# EasyEDA Pro project CanMV-K230-LP4-V3.0-立创文件.epro, board CanMV-K230-LP4-V3.0_20240509
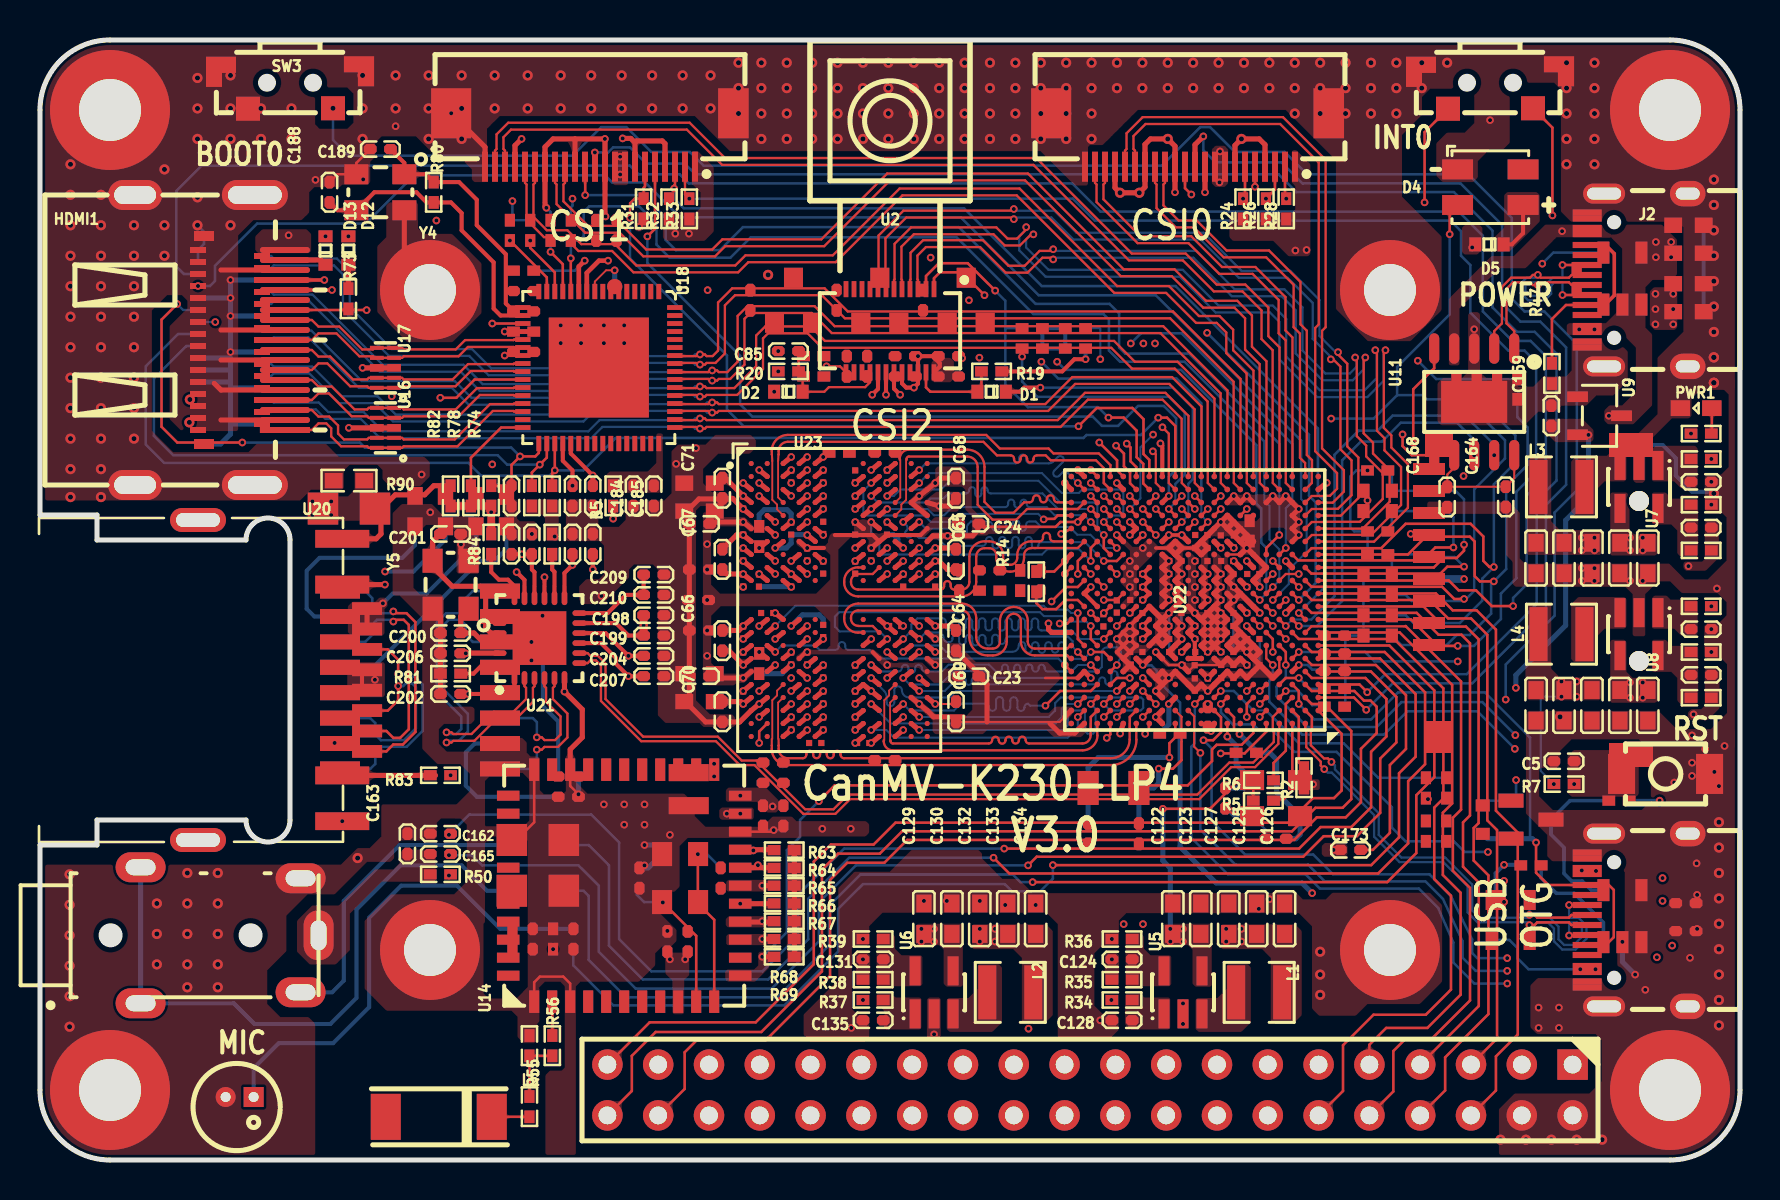
[diagram p7: board, top side]
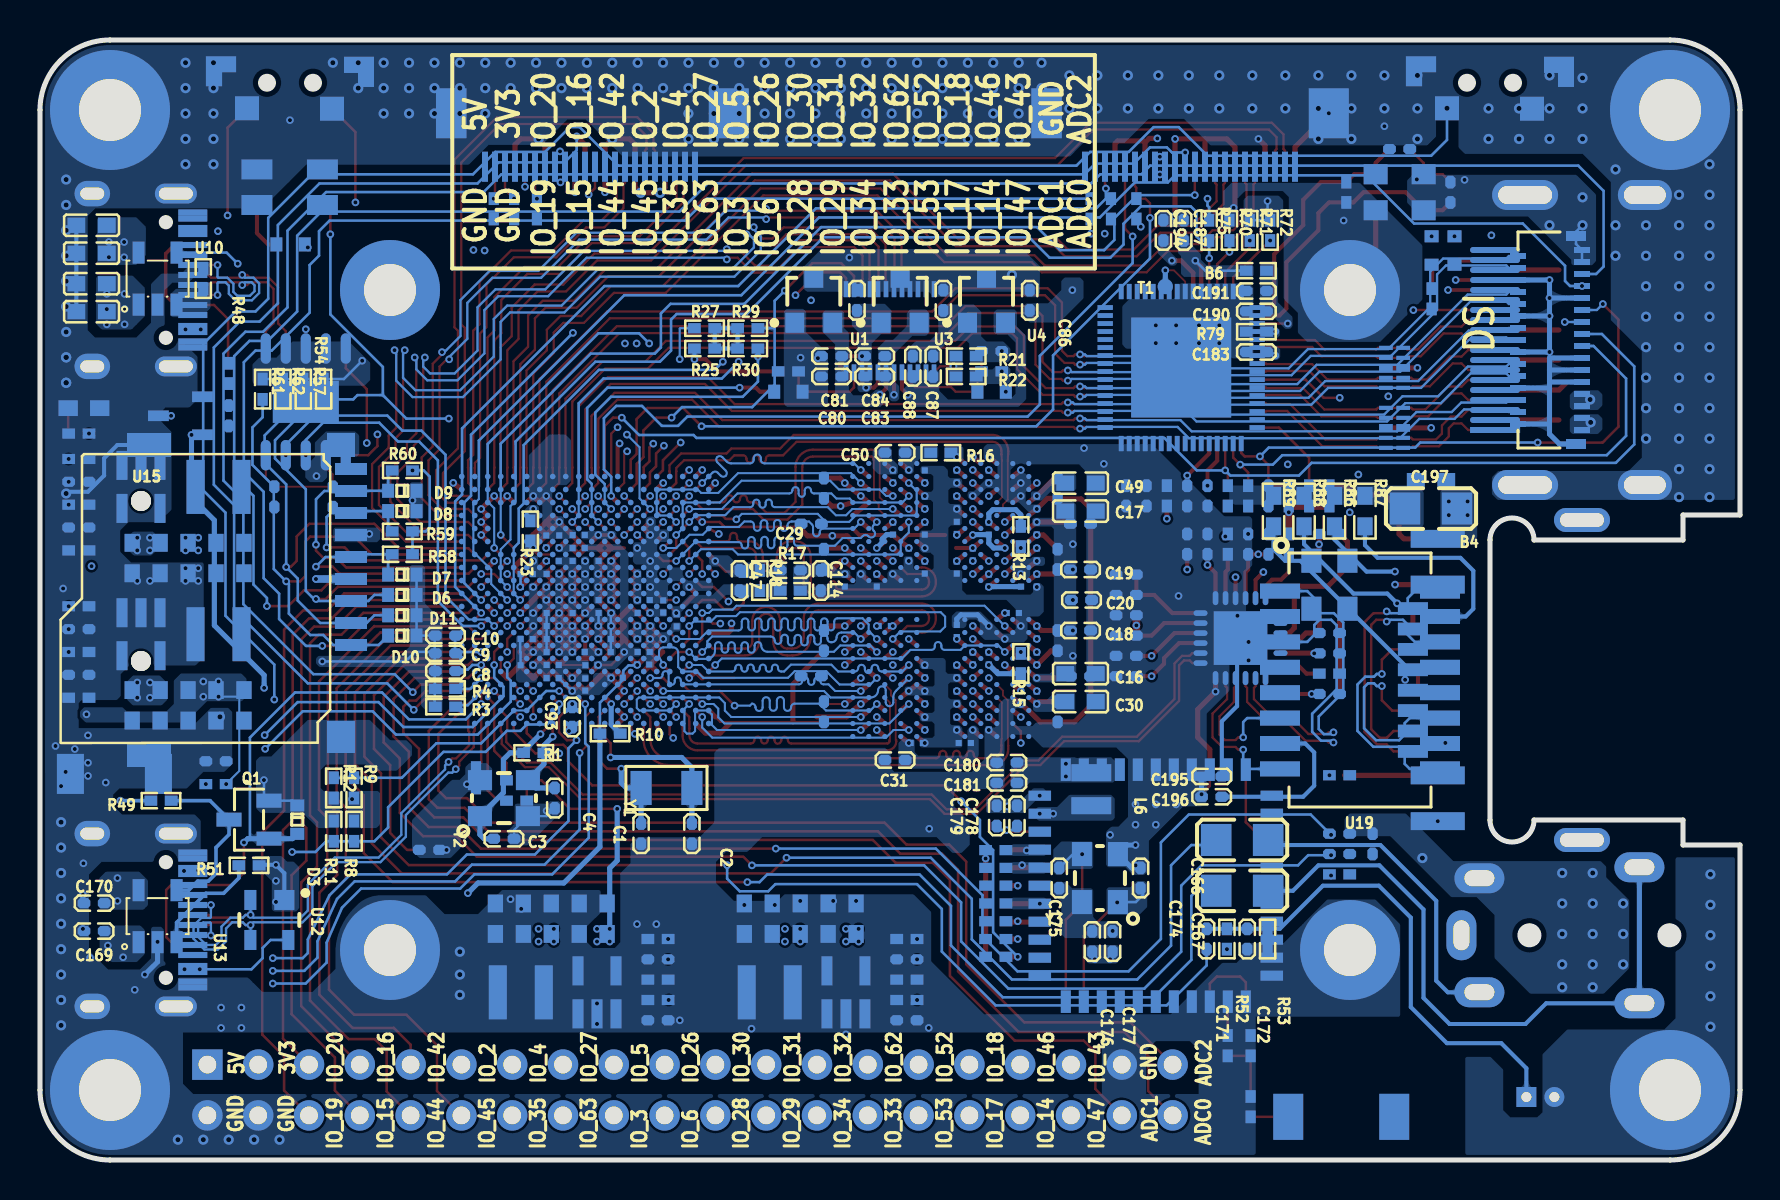
[diagram p8: board, bottom side, seen from below]

Outline 85 x 56 mm; copper layers: Top Layer, GND2, Signal3, POWER4, GND5, Bottom Layer. Coordinates in mm from the lower left corner of the outline.
Outline path: 0,52.5 arc(1.03,54.97) 3.5,56 81.5,56 arc(83.97,54.97) 85,52.5 85,3.5 arc(83.97,1.03) 81.5,0 3.5,0 arc(1.03,1.03) 0,3.5 0,15.75 2.85,15.75 2.85,17 10.3,17 arc(11.4,15.9) 12.5,17 12.5,31 arc(11.4,32.1) 10.3,31 2.85,31 2.85,32.25 0,32.25 0,52.5
Stack: Top Layer 0.035mm 外层铜厚1oz / Dielectric1 0.0994mm 3313 RC57% 4.2mil / GND2 0.035mm - / Dielectric2 0.55mm 0.55mm H/H不含铜 / Signal3 0.035mm - / Dielectric3 0.1088mm 2116 RC54% 4.9mil / POWER4 0.035mm - / Dielectric4 0.55mm 0.55mm H/H不含铜 / GND5 0.035mm - / Dielectric5 0.0994mm 3313 RC57% 4.2mil / Bottom Layer 0.035mm 外层铜厚1oz

## Design rules (mm)
net DSI_D3_P: DSI_D3_
net DSI_D2_N: DSI_D2_
net DSI_CLK_P: DSI_CLK_
net DSI_CLK_N: DSI_CLK_
net DSI_D2_P: DSI_D2_
net DSI_D3_N: DSI_D3_
net DSI_D1_P: DSI_D1_
net DSI_D1_N: DSI_D1_
net DSI_D0_P: DSI_D0_
net DSI_D0_N: DSI_D0_
net USB_N: USB_
net USB_P: USB_
net USB0_N: USB0_
net USB0_P: USB0_
net HDMI_CLK_N: HDMI_CLK_
net HDMI_CLK_P: HDMI_CLK_
net HDMI_D0_N: HDMI_D0_
net HDMI_D0_P: HDMI_D0_
net HDMI_D1_N: HDMI_D1_
net HDMI_D1_P: HDMI_D1_
net HDMI_D2_N: HDMI_D2_
net HDMI_D2_P: HDMI_D2_
net USB1_P: USB1_
net USB1_N: USB1_
net RD_P: RD_
net RD_N: RD_
net TD_N: TD_
net TD_P: TD_
net TX_P: TX_
net TX_N: TX_
net RX_P: RX_
net RX_N: RX_
net CSI2_D5_N: CSI2_D5_
net CSI2_CLK_P: CSI2_CLK_
net CSI2_CLK_N: CSI2_CLK_
net CSI2_D4_P: CSI2_D4_
net CSI2_D4_N: CSI2_D4_
net CSI2_D5_P: CSI2_D5_
net CSI0_D0_N: CSI0_D0_
net CSI0_D0_P: CSI0_D0_
net CSI0_D1_N: CSI0_D1_
net CSI0_D1_P: CSI0_D1_
net CSI0_CLK_N: CSI0_CLK_
net CSI0_CLK_P: CSI0_CLK_
net CSI1_D2_N: CSI1_D2_
net CSI1_D2_P: CSI1_D2_
net CSI1_D3_N: CSI1_D3_
net CSI1_D3_P: CSI1_D3_
net CSI1_CLK_N: CSI1_CLK_
net CSI1_CLK_P: CSI1_CLK_
net DDR_DQSA0_P: DDR_DQSA0_
net DDR_DQSA0_N: DDR_DQSA0_
net DDR_CLKA_N: DDR_CLKA_
net DDR_CLKA_P: DDR_CLKA_
net DDR_DQSA1_P: DDR_DQSA1_
net DDR_DQSA1_N: DDR_DQSA1_
net DDR_DQSB1_P: DDR_DQSB1_
net DDR_DQSB0_P: DDR_DQSB0_
net DDR_DQSB1_N: DDR_DQSB1_
net DDR_DQSB0_N: DDR_DQSB0_
net DDR_CLKB_P: DDR_CLKB_
net DDR_CLKB_N: DDR_CLKB_
spacing copperThickness1oz (default): track to track 0.076, other pairs 0.076 to 0.3
spacing copperThickness2oz: track to track 0.203, other pairs 0.152 to 0.3
spacing Plane_innerPlane: track to track 0.076, other pairs 0.076 to 0.3
spacing Copper_copperRegion: track to track 0.076, other pairs 0.076 to 0.3
track width copperThickness1oz (default): min 0.064, default 0.254, max 2.54
track width copperThickness2oz: min 0.203, default 0.254, max 2.54
differential pair DF_L1_90 (default): width min 0.114, default 0.114, max 2.54; gap min 0.102, default 0.114
differential pair DF_L1_100: width min 0.076, default 0.114, max 2.54; gap min 0.127, default 0.229
net VDD_5V uses Copper_copperRegion, Plane_innerPlane
net VDD_3V3 uses Copper_copperRegion, Plane_innerPlane
net GND uses Copper_copperRegion, Plane_innerPlane
net DSI_D3_P uses Copper_copperRegion, DF_L1_100, Plane_innerPlane
net DSI_D2_N uses Copper_copperRegion, DF_L1_100, Plane_innerPlane
net DSI_CLK_P uses Copper_copperRegion, DF_L1_100, Plane_innerPlane
net DSI_CLK_N uses Copper_copperRegion, DF_L1_100, Plane_innerPlane
net DSI_D2_P uses Copper_copperRegion, DF_L1_100, Plane_innerPlane
net DSI_D3_N uses Copper_copperRegion, DF_L1_100, Plane_innerPlane
net DSI_D1_P uses Copper_copperRegion, DF_L1_100, Plane_innerPlane
net DSI_D1_N uses Copper_copperRegion, DF_L1_100, Plane_innerPlane
net DSI_D0_P uses Copper_copperRegion, DF_L1_100, Plane_innerPlane
net DSI_D0_N uses Copper_copperRegion, DF_L1_100, Plane_innerPlane
net AVDD1P8_MIPI uses Copper_copperRegion, Plane_innerPlane
net AVDD0P8_MIPI uses Copper_copperRegion, Plane_innerPlane
net VDD0V8_CORE uses Copper_copperRegion, Plane_innerPlane
net CAM0_SCL uses Copper_copperRegion, Plane_innerPlane
net CAM0_SDA uses Copper_copperRegion, Plane_innerPlane
net VDD_1V8_RTC uses Copper_copperRegion, Plane_innerPlane
net VAA_DDR uses Copper_copperRegion, Plane_innerPlane
net AVDD_0V8_PLL uses Copper_copperRegion, Plane_innerPlane
net $3N3692 uses Copper_copperRegion, Plane_innerPlane
net $3N3710 uses Copper_copperRegion, Plane_innerPlane
net $3N3712 uses Copper_copperRegion, Plane_innerPlane
net $3N3722 uses Copper_copperRegion, Plane_innerPlane
net $3N3721 uses Copper_copperRegion, Plane_innerPlane
net $3N3720 uses Copper_copperRegion, Plane_innerPlane
net $3N3719 uses Copper_copperRegion, Plane_innerPlane
net $3N3716 uses Copper_copperRegion, Plane_innerPlane
net $3N3717 uses Copper_copperRegion, Plane_innerPlane
net $3N3718 uses Copper_copperRegion, Plane_innerPlane
net $3N3715 uses Copper_copperRegion, Plane_innerPlane
net $3N3714 uses Copper_copperRegion, Plane_innerPlane
net $3N3711 uses Copper_copperRegion, Plane_innerPlane
net USB_N uses Copper_copperRegion, Plane_innerPlane
net USB_P uses Copper_copperRegion, Plane_innerPlane
net USB_CC uses Copper_copperRegion, Plane_innerPlane
net USB_VIN uses Copper_copperRegion, Plane_innerPlane
net USB0_N uses Copper_copperRegion, Plane_innerPlane
net USB0_P uses Copper_copperRegion, Plane_innerPlane
net USB0_CC1 uses Copper_copperRegion, Plane_innerPlane
net USB_VBUS uses Copper_copperRegion, Plane_innerPlane
net TXD1_CH342 uses Copper_copperRegion, Plane_innerPlane
net RXD0_CH342 uses Copper_copperRegion, Plane_innerPlane
net TXD0_CH342 uses Copper_copperRegion, Plane_innerPlane
net RXD1_CH342 uses Copper_copperRegion, Plane_innerPlane
net TFCARD_D1 uses Copper_copperRegion, Plane_innerPlane
net TFCARD_D3 uses Copper_copperRegion, Plane_innerPlane
net TFCARD_D0 uses Copper_copperRegion, Plane_innerPlane
net TFCARD_D2 uses Copper_copperRegion, Plane_innerPlane
net OTG_VBUS_EN uses Copper_copperRegion, Plane_innerPlane
net $4N2513 uses Copper_copperRegion, Plane_innerPlane
net MIC_PR uses Copper_copperRegion, Plane_innerPlane
net $4N2560 uses Copper_copperRegion, Plane_innerPlane
net MIC_NR uses Copper_copperRegion, Plane_innerPlane
net RSTN uses Copper_copperRegion, Plane_innerPlane
net INT0 uses Copper_copperRegion, Plane_innerPlane
net $4N2608 uses Copper_copperRegion, Plane_innerPlane
net RF_INOUT uses Copper_copperRegion, Plane_innerPlane
net 26MHZ_XIN uses Copper_copperRegion, Plane_innerPlane
net 26MHZ_XOUT uses Copper_copperRegion, Plane_innerPlane
net $4N2601 uses Copper_copperRegion, Plane_innerPlane
net $4N2602 uses Copper_copperRegion, Plane_innerPlane
net BANK2_GPIO35 uses Copper_copperRegion, Plane_innerPlane
net OUT0 uses Copper_copperRegion, Plane_innerPlane
net $4N2644 uses Copper_copperRegion, Plane_innerPlane
net $4N2660 uses Copper_copperRegion, Plane_innerPlane
net BOOT0 uses Copper_copperRegion, Plane_innerPlane
net 32K768_XIN uses Copper_copperRegion, Plane_innerPlane
net 32K768_XOUT uses Copper_copperRegion, Plane_innerPlane
net 24M_XIN uses Copper_copperRegion, Plane_innerPlane
net 24M_XOUT uses Copper_copperRegion, Plane_innerPlane
net BOOT1 uses Copper_copperRegion, Plane_innerPlane
net INT4 uses Copper_copperRegion, Plane_innerPlane
net HDMI_HPD uses Copper_copperRegion, Plane_innerPlane
net $6N1854 uses Copper_copperRegion, Plane_innerPlane
net HDMI_CEC uses Copper_copperRegion, Plane_innerPlane
net HDMI_CLK_N uses Copper_copperRegion, DF_L1_100, Plane_innerPlane
net HDMI_CLK_P uses Copper_copperRegion, DF_L1_100, Plane_innerPlane
net HDMI_D0_N uses Copper_copperRegion, DF_L1_100, Plane_innerPlane
net HDMI_D0_P uses Copper_copperRegion, DF_L1_100, Plane_innerPlane
net HDMI_D1_N uses Copper_copperRegion, DF_L1_100, Plane_innerPlane
net HDMI_D1_P uses Copper_copperRegion, DF_L1_100, Plane_innerPlane
net HDMI_D2_N uses Copper_copperRegion, DF_L1_100, Plane_innerPlane
net HDMI_D2_P uses Copper_copperRegion, DF_L1_100, Plane_innerPlane
net $6N1907 uses Copper_copperRegion, Plane_innerPlane
net VDD_1V8_RX uses Copper_copperRegion, Plane_innerPlane
net $6N2102 uses Copper_copperRegion, Plane_innerPlane
net $6N1668 uses Copper_copperRegion, Plane_innerPlane
net VDD_1V8_TX uses Copper_copperRegion, Plane_innerPlane
net LT9611_XTALI uses Copper_copperRegion, Plane_innerPlane
net LT9611_XTALO uses Copper_copperRegion, Plane_innerPlane
net $6N1656 uses Copper_copperRegion, Plane_innerPlane
net $6N1761 uses Copper_copperRegion, Plane_innerPlane
net USB1_P uses Copper_copperRegion, Plane_innerPlane
net USB1_N uses Copper_copperRegion, Plane_innerPlane
net RD_P uses Copper_copperRegion, DF_L1_100, Plane_innerPlane
net RD_N uses Copper_copperRegion, DF_L1_100, Plane_innerPlane
net $6N3172 uses Copper_copperRegion, Plane_innerPlane
net AVDD10 uses Copper_copperRegion, Plane_innerPlane
net XTAL_IN uses Copper_copperRegion, Plane_innerPlane
net XTAL_OUT uses Copper_copperRegion, Plane_innerPlane
net $6N3162 uses Copper_copperRegion, Plane_innerPlane
net SPEED_LED uses Copper_copperRegion, Plane_innerPlane
net LINK_LED uses Copper_copperRegion, Plane_innerPlane
net $6N3165 uses Copper_copperRegion, Plane_innerPlane
net AVDD33 uses Copper_copperRegion, Plane_innerPlane
net DVDD10_UPS uses Copper_copperRegion, Plane_innerPlane
net TD_N uses Copper_copperRegion, DF_L1_100, Plane_innerPlane
net TD_P uses Copper_copperRegion, DF_L1_100, Plane_innerPlane
net $6N3905 uses Copper_copperRegion, Plane_innerPlane
net $6N3909 uses Copper_copperRegion, Plane_innerPlane
net TX_P uses Copper_copperRegion, DF_L1_100, Plane_innerPlane
net TX_N uses Copper_copperRegion, DF_L1_100, Plane_innerPlane
net RX_P uses Copper_copperRegion, DF_L1_100, Plane_innerPlane
net $6N3846 uses Copper_copperRegion, Plane_innerPlane
net RX_N uses Copper_copperRegion, DF_L1_100, Plane_innerPlane
net $6N3852 uses Copper_copperRegion, Plane_innerPlane
net $6N3869 uses Copper_copperRegion, Plane_innerPlane
net $6N3872 uses Copper_copperRegion, Plane_innerPlane
net $6N3875 uses Copper_copperRegion, Plane_innerPlane
net $6N3878 uses Copper_copperRegion, Plane_innerPlane
net $4N3243 uses Copper_copperRegion, Plane_innerPlane
net $4N3256 uses Copper_copperRegion, Plane_innerPlane
net $4N3254 uses Copper_copperRegion, Plane_innerPlane
net MIC_BIAS uses Copper_copperRegion, Plane_innerPlane
net VDD_1V5 uses Copper_copperRegion, Plane_innerPlane
net BANK0_GPIO2 uses Copper_copperRegion, Plane_innerPlane
net BANK0_GPIO4 uses Copper_copperRegion, Plane_innerPlane
net BANK0_GPIO3 uses Copper_copperRegion, Plane_innerPlane
net BANK2_GPIO27 uses Copper_copperRegion, Plane_innerPlane
net BANK0_GPIO5 uses Copper_copperRegion, Plane_innerPlane
net BANK0_GPIO6 uses Copper_copperRegion, Plane_innerPlane
net BANK2_GPIO28 uses Copper_copperRegion, Plane_innerPlane
net BANK2_GPIO33 uses Copper_copperRegion, Plane_innerPlane
net BANK2_GPIO26 uses Copper_copperRegion, Plane_innerPlane
net BANK2_GPIO30 uses Copper_copperRegion, Plane_innerPlane
net BANK2_GPIO29 uses Copper_copperRegion, Plane_innerPlane
net BANK2_GPIO32 uses Copper_copperRegion, Plane_innerPlane
net BANK2_GPIO31 uses Copper_copperRegion, Plane_innerPlane
net BANK2_GPIO34 uses Copper_copperRegion, Plane_innerPlane
net BANK3_GPIO43 uses Copper_copperRegion, Plane_innerPlane
net BANK1_GPIO18 uses Copper_copperRegion, Plane_innerPlane
net BANK1_GPIO14 uses Copper_copperRegion, Plane_innerPlane
net BANK4_GPIO53 uses Copper_copperRegion, Plane_innerPlane
net BANK1_GPIO17 uses Copper_copperRegion, Plane_innerPlane
net BANK4_GPIO52 uses Copper_copperRegion, Plane_innerPlane
net ADC0 uses Copper_copperRegion, Plane_innerPlane
net ADC2 uses Copper_copperRegion, Plane_innerPlane
net ADC1 uses Copper_copperRegion, Plane_innerPlane
net BANK1_GPIO16 uses Copper_copperRegion, Plane_innerPlane
net BANK1_GPIO15 uses Copper_copperRegion, Plane_innerPlane
net BANK1_GPIO19 uses Copper_copperRegion, Plane_innerPlane
net CAM1_SCL uses Copper_copperRegion, Plane_innerPlane
net CAM1_SDA uses Copper_copperRegion, Plane_innerPlane
net CSI2_D5_N uses Copper_copperRegion, DF_L1_100, Plane_innerPlane
net CSI2_CLK_P uses Copper_copperRegion, DF_L1_100, Plane_innerPlane
net CSI2_CLK_N uses Copper_copperRegion, DF_L1_100, Plane_innerPlane
net CSI2_D4_P uses Copper_copperRegion, DF_L1_100, Plane_innerPlane
net CSI2_D4_N uses Copper_copperRegion, DF_L1_100, Plane_innerPlane
net CSI2_D5_P uses Copper_copperRegion, DF_L1_100, Plane_innerPlane
net CSI0_D0_N uses Copper_copperRegion, DF_L1_100, Plane_innerPlane
net CSI0_D0_P uses Copper_copperRegion, DF_L1_100, Plane_innerPlane
net CSI0_D1_N uses Copper_copperRegion, DF_L1_100, Plane_innerPlane
net CSI0_D1_P uses Copper_copperRegion, DF_L1_100, Plane_innerPlane
net CSI0_CLK_N uses Copper_copperRegion, DF_L1_100, Plane_innerPlane
net CSI0_CLK_P uses Copper_copperRegion, DF_L1_100, Plane_innerPlane
net CSI1_D2_N uses Copper_copperRegion, DF_L1_100, Plane_innerPlane
net CSI1_D2_P uses Copper_copperRegion, DF_L1_100, Plane_innerPlane
net CSI1_D3_N uses Copper_copperRegion, DF_L1_100, Plane_innerPlane
net CSI1_D3_P uses Copper_copperRegion, DF_L1_100, Plane_innerPlane
net CSI1_CLK_N uses Copper_copperRegion, DF_L1_100, Plane_innerPlane
net CSI1_CLK_P uses Copper_copperRegion, DF_L1_100, Plane_innerPlane
net $5N4846 uses Copper_copperRegion, Plane_innerPlane
net $1N6877 uses Copper_copperRegion, Plane_innerPlane
net $1N6883 uses Copper_copperRegion, Plane_innerPlane
net $1N6885 uses Copper_copperRegion, Plane_innerPlane
net $1N6887 uses Copper_copperRegion, Plane_innerPlane
net $1N6889 uses Copper_copperRegion, Plane_innerPlane
net HP_OUTL uses Copper_copperRegion, Plane_innerPlane
net HP_OUTR uses Copper_copperRegion, Plane_innerPlane
net MIC_PL uses Copper_copperRegion, Plane_innerPlane
net MIC_NL uses Copper_copperRegion, Plane_innerPlane
net TFCARD_CMD uses Copper_copperRegion, Plane_innerPlane
net TFCARD_CLK uses Copper_copperRegion, Plane_innerPlane
net VDD_1V8 uses Copper_copperRegion, Plane_innerPlane
net WIFI_REGON uses Copper_copperRegion, Plane_innerPlane
net $1N9693 uses Copper_copperRegion, Plane_innerPlane
net AVDD_2V8 uses Copper_copperRegion, Plane_innerPlane
net DVDD_2V8 uses Copper_copperRegion, Plane_innerPlane
net $5N10965 uses Copper_copperRegion, Plane_innerPlane
net $5N10986 uses Copper_copperRegion, Plane_innerPlane
net HDMI_INT uses Copper_copperRegion, Plane_innerPlane
net HDMI_RSTN uses Copper_copperRegion, Plane_innerPlane
net MCLK1 uses Copper_copperRegion, Plane_innerPlane
net BANK5_GPIO62 uses Copper_copperRegion, Plane_innerPlane
net BANK5_GPIO63 uses Copper_copperRegion, Plane_innerPlane
net BANK3_GPIO42 uses Copper_copperRegion, Plane_innerPlane
net LCD_RST uses Copper_copperRegion, Plane_innerPlane
net LCD_EN uses Copper_copperRegion, Plane_innerPlane
net ADC4 uses Copper_copperRegion, Plane_innerPlane
net ADC5 uses Copper_copperRegion, Plane_innerPlane
net GPIO11 uses Copper_copperRegion, Plane_innerPlane
net GPIO9 uses Copper_copperRegion, Plane_innerPlane
net GPIO10 uses Copper_copperRegion, Plane_innerPlane
net GPIO12 uses Copper_copperRegion, Plane_innerPlane
net WIFI_CLK uses Copper_copperRegion, Plane_innerPlane
net WIFI_CMD uses Copper_copperRegion, Plane_innerPlane
net WIFI_D3 uses Copper_copperRegion, Plane_innerPlane
net WIFI_D2 uses Copper_copperRegion, Plane_innerPlane
net WIFI_D1 uses Copper_copperRegion, Plane_innerPlane
net WIFI_D0 uses Copper_copperRegion, Plane_innerPlane
net BANK3_GPIO47 uses Copper_copperRegion, Plane_innerPlane
net BANK3_GPIO46 uses Copper_copperRegion, Plane_innerPlane
net CAM2_SDA uses Copper_copperRegion, Plane_innerPlane
net CAM2_SCL uses Copper_copperRegion, Plane_innerPlane
net HDMI_SCL uses Copper_copperRegion, Plane_innerPlane
net HDMI_SDA uses Copper_copperRegion, Plane_innerPlane
net HDMI_CSCL uses Copper_copperRegion, Plane_innerPlane
net HDMI_CSDA uses Copper_copperRegion, Plane_innerPlane
net ADC3 uses Copper_copperRegion, Plane_innerPlane
net CAM2_RST uses Copper_copperRegion, Plane_innerPlane
net GPIO60 uses Copper_copperRegion, Plane_innerPlane
net GPIO61 uses Copper_copperRegion, Plane_innerPlane
net BANK3_GPIO45 uses Copper_copperRegion, Plane_innerPlane
net BANK3_GPIO44 uses Copper_copperRegion, Plane_innerPlane
net BANK1_GPIO20 uses Copper_copperRegion, Plane_innerPlane
net $4N29180 uses Copper_copperRegion, Plane_innerPlane
net $5N21116 uses Copper_copperRegion, Plane_innerPlane
net VDD_1V1 uses Copper_copperRegion, Plane_innerPlane
net $2N24907 uses Copper_copperRegion, Plane_innerPlane
net $2N24909 uses Copper_copperRegion, Plane_innerPlane
net $2N24911 uses Copper_copperRegion, Plane_innerPlane
net DDR_VREF uses Copper_copperRegion, Plane_innerPlane
net DDR_DQA4 uses Copper_copperRegion, Plane_innerPlane
net DDR_DQSA0_P uses Copper_copperRegion, DF_L1_100, Plane_innerPlane
net DDR_DQA8 uses Copper_copperRegion, Plane_innerPlane
net DDR_DQA6 uses Copper_copperRegion, Plane_innerPlane
net DDR_DQSA0_N uses Copper_copperRegion, DF_L1_100, Plane_innerPlane
net DDR_DQA3 uses Copper_copperRegion, Plane_innerPlane
net DDR_DQA10 uses Copper_copperRegion, Plane_innerPlane
net DDR_DQA15 uses Copper_copperRegion, Plane_innerPlane
net DDR_DQA1 uses Copper_copperRegion, Plane_innerPlane
net DDR_DQA9 uses Copper_copperRegion, Plane_innerPlane
net DDR_DQA12 uses Copper_copperRegion, Plane_innerPlane
net DDR_DMIA1 uses Copper_copperRegion, Plane_innerPlane
net DDR_DQA13 uses Copper_copperRegion, Plane_innerPlane
net DDR_CSA0 uses Copper_copperRegion, Plane_innerPlane
net DDR_CSA1 uses Copper_copperRegion, Plane_innerPlane
net DDR_CLKA_N uses Copper_copperRegion, DF_L1_100, Plane_innerPlane
net DDR_CLKA_P uses Copper_copperRegion, DF_L1_100, Plane_innerPlane
net DDR_CAA5 uses Copper_copperRegion, Plane_innerPlane
net DDR_DQA11 uses Copper_copperRegion, Plane_innerPlane
net DDR_DQA7 uses Copper_copperRegion, Plane_innerPlane
net DDR_DQA0 uses Copper_copperRegion, Plane_innerPlane
net DDR_DQA14 uses Copper_copperRegion, Plane_innerPlane
net DDR_DQA5 uses Copper_copperRegion, Plane_innerPlane
net DDR_DMIA0 uses Copper_copperRegion, Plane_innerPlane
net DDR_DQA2 uses Copper_copperRegion, Plane_innerPlane
net DDR_DQSA1_P uses Copper_copperRegion, DF_L1_100, Plane_innerPlane
net DDR_DQSA1_N uses Copper_copperRegion, DF_L1_100, Plane_innerPlane
net DDR_CAB2 uses Copper_copperRegion, Plane_innerPlane
net DDR_CAB4 uses Copper_copperRegion, Plane_innerPlane
net DDR_CAB3 uses Copper_copperRegion, Plane_innerPlane
net DDR_DQB11 uses Copper_copperRegion, Plane_innerPlane
net DDR_DQB10 uses Copper_copperRegion, Plane_innerPlane
net DDR_DMIB1 uses Copper_copperRegion, Plane_innerPlane
net DDR_DQB13 uses Copper_copperRegion, Plane_innerPlane
net DDR_DQB14 uses Copper_copperRegion, Plane_innerPlane
net DDR_DQB4 uses Copper_copperRegion, Plane_innerPlane
net DDR_DQB12 uses Copper_copperRegion, Plane_innerPlane
net DDR_DQB15 uses Copper_copperRegion, Plane_innerPlane
net DDR_DQB6 uses Copper_copperRegion, Plane_innerPlane
net DDR_DMIB0 uses Copper_copperRegion, Plane_innerPlane
net DDR_DQB5 uses Copper_copperRegion, Plane_innerPlane
net DDR_DQSB1_P uses Copper_copperRegion, DF_L1_100, Plane_innerPlane
net DDR_DQB7 uses Copper_copperRegion, Plane_innerPlane
net DDR_DQB0 uses Copper_copperRegion, Plane_innerPlane
net DDR_DQSB0_P uses Copper_copperRegion, DF_L1_100, Plane_innerPlane
net DDR_DQB2 uses Copper_copperRegion, Plane_innerPlane
net DDR_DQSB1_N uses Copper_copperRegion, DF_L1_100, Plane_innerPlane
net DDR_DQB1 uses Copper_copperRegion, Plane_innerPlane
net DDR_DQSB0_N uses Copper_copperRegion, DF_L1_100, Plane_innerPlane
net DDR_DQB3 uses Copper_copperRegion, Plane_innerPlane
net DDR_CLKB_P uses Copper_copperRegion, DF_L1_100, Plane_innerPlane
net DDR_CAB1 uses Copper_copperRegion, Plane_innerPlane
net DDR_CLKB_N uses Copper_copperRegion, DF_L1_100, Plane_innerPlane
net DDR_CAB5 uses Copper_copperRegion, Plane_innerPlane
net DDR_CAB0 uses Copper_copperRegion, Plane_innerPlane
net DDR_DQB8 uses Copper_copperRegion, Plane_innerPlane
net DDR_DQB9 uses Copper_copperRegion, Plane_innerPlane
net DDR_CAA1 uses Copper_copperRegion, Plane_innerPlane
net DDR_CKEA0 uses Copper_copperRegion, Plane_innerPlane
net DDR_CAA4 uses Copper_copperRegion, Plane_innerPlane
net DDR_CKEB0 uses Copper_copperRegion, Plane_innerPlane
net DDR_RESET uses Copper_copperRegion, Plane_innerPlane
net DDR_CAA3 uses Copper_copperRegion, Plane_innerPlane
net DDR_CAA2 uses Copper_copperRegion, Plane_innerPlane
net DDR_CAA0 uses Copper_copperRegion, Plane_innerPlane
net DDR_CSB0 uses Copper_copperRegion, Plane_innerPlane
net $2N25660 uses Copper_copperRegion, Plane_innerPlane
net NETC182_1 uses Copper_copperRegion, Plane_innerPlane
net $4N43326 uses Copper_copperRegion, Plane_innerPlane
net $5N27856 uses Copper_copperRegion, Plane_innerPlane
net $6N25767 uses Copper_copperRegion, Plane_innerPlane
net PGND uses Copper_copperRegion, Plane_innerPlane
diff pair DSI_D3_ uses DF_L1_100
diff pair DSI_D2_ uses DF_L1_100
diff pair DSI_CLK_ uses DF_L1_100
diff pair DSI_D1_ uses DF_L1_100
diff pair DSI_D0_ uses DF_L1_100
diff pair HDMI_CLK_ uses DF_L1_100
diff pair HDMI_D0_ uses DF_L1_100
diff pair HDMI_D1_ uses DF_L1_100
diff pair HDMI_D2_ uses DF_L1_100
diff pair RD_ uses DF_L1_100
diff pair TD_ uses DF_L1_100
diff pair TX_ uses DF_L1_100
diff pair RX_ uses DF_L1_100
diff pair CSI2_D5_ uses DF_L1_100
diff pair CSI2_CLK_ uses DF_L1_100
diff pair CSI2_D4_ uses DF_L1_100
diff pair CSI0_D0_ uses DF_L1_100
diff pair CSI0_D1_ uses DF_L1_100
diff pair CSI0_CLK_ uses DF_L1_100
diff pair CSI1_D2_ uses DF_L1_100
diff pair CSI1_D3_ uses DF_L1_100
diff pair CSI1_CLK_ uses DF_L1_100
diff pair DDR_DQSA0_ uses DF_L1_100
diff pair DDR_CLKA_ uses DF_L1_100
diff pair DDR_DQSA1_ uses DF_L1_100
diff pair DDR_DQSB1_ uses DF_L1_100
diff pair DDR_DQSB0_ uses DF_L1_100
diff pair DDR_CLKB_ uses DF_L1_100
pour e6732 uses Copper_copperRegion, copperRegion
pour e6349 uses Copper_copperRegion
pour e6351 uses Copper_copperRegion
pour e6353 uses Copper_copperRegion
pour e6355 uses Copper_copperRegion
pour e6357 uses Copper_copperRegion
pour e6359 uses Copper_copperRegion
pour e6361 uses Copper_copperRegion
pour e6363 uses Copper_copperRegion
pour e6365 uses Copper_copperRegion
pour e6367 uses Copper_copperRegion
pour e6369 uses Copper_copperRegion
pour e6371 uses Copper_copperRegion
pour e6373 uses Copper_copperRegion
pour e6375 uses Copper_copperRegion
pour e6377 uses Copper_copperRegion
pour e6379 uses Copper_copperRegion
pour e6381 uses Copper_copperRegion
pour e6383 uses Copper_copperRegion
pour e6385 uses Copper_copperRegion
pour e6387 uses Copper_copperRegion
pour e6389 uses Copper_copperRegion
pour e6391 uses Copper_copperRegion
pour e6393 uses Copper_copperRegion
pour e6395 uses Copper_copperRegion
pour e6397 uses Copper_copperRegion
pour e6399 uses Copper_copperRegion
pour e6401 uses Copper_copperRegion
pour e6403 uses Copper_copperRegion
pour e6405 uses Copper_copperRegion
pour e6407 uses Copper_copperRegion
pour e6409 uses Copper_copperRegion
pour e6411 uses Copper_copperRegion
pour e6413 uses Copper_copperRegion
pour e6415 uses Copper_copperRegion
pour e6417 uses Copper_copperRegion
pour e6419 uses Copper_copperRegion
pour e6421 uses Copper_copperRegion
pour e6423 uses Copper_copperRegion
pour e6425 uses Copper_copperRegion
pour e6427 uses Copper_copperRegion
pour e6429 uses Copper_copperRegion
pour e6431 uses Copper_copperRegion
pour e6434 uses Copper_copperRegion
pour e6436 uses Copper_copperRegion
pour e6438 uses Copper_copperRegion
pour e6440 uses Copper_copperRegion
pour e6442 uses Copper_copperRegion
pour e6445 uses Copper_copperRegion
pour e6447 uses Copper_copperRegion
pour e6449 uses Copper_copperRegion
pour e6451 uses Copper_copperRegion
pour e6453 uses Copper_copperRegion
pour e6455 uses Copper_copperRegion
pour e6457 uses Copper_copperRegion
pour e6459 uses Copper_copperRegion
pour e6461 uses Copper_copperRegion
pour e6463 uses Copper_copperRegion
pour e6465 uses Copper_copperRegion
pour e6467 uses Copper_copperRegion
pour e6469 uses Copper_copperRegion
pour e6471 uses Copper_copperRegion
pour e6473 uses Copper_copperRegion
pour e6475 uses Copper_copperRegion
pour e6477 uses Copper_copperRegion
pour e6479 uses Copper_copperRegion
pour e6481 uses Copper_copperRegion
pour e6483 uses Copper_copperRegion
pour e6485 uses Copper_copperRegion
pour e6487 uses Copper_copperRegion
pour e6489 uses Copper_copperRegion
pour e6491 uses Copper_copperRegion
pour e6493 uses Copper_copperRegion
pour e6495 uses Copper_copperRegion
pour e6497 uses Copper_copperRegion
pour e6499 uses Copper_copperRegion
pour e6501 uses Copper_copperRegion
pour e6503 uses Copper_copperRegion
pour e6505 uses Copper_copperRegion
pour e6507 uses Copper_copperRegion
pour e6509 uses Copper_copperRegion
pour e6511 uses Copper_copperRegion
pour e6513 uses Copper_copperRegion
pour e6515 uses Copper_copperRegion
pour e6517 uses Copper_copperRegion
pour e6519 uses Copper_copperRegion
pour e6521 uses Copper_copperRegion
pour e6523 uses Copper_copperRegion
pour e6525 uses Copper_copperRegion
pour e6528 uses Copper_copperRegion
pour e6530 uses Copper_copperRegion
pour e6532 uses Copper_copperRegion
pour e6534 uses Copper_copperRegion
pour e6536 uses Copper_copperRegion
pour e6538 uses Copper_copperRegion
pour e6540 uses Copper_copperRegion
pour e6542 uses Copper_copperRegion
pour e6544 uses Copper_copperRegion
pour e6546 uses Copper_copperRegion
pour e6548 uses Copper_copperRegion
pour e6550 uses Copper_copperRegion
pour e6552 uses Copper_copperRegion
pour e6554 uses Copper_copperRegion
pour e6556 uses Copper_copperRegion
pour e6558 uses Copper_copperRegion
pour e6560 uses Copper_copperRegion
pour e6562 uses Copper_copperRegion
pour e6564 uses Copper_copperRegion
pour e6566 uses Copper_copperRegion
pour e6568 uses Copper_copperRegion
pour e6570 uses Copper_copperRegion
pour e6572 uses Copper_copperRegion
pour e6574 uses Copper_copperRegion
pour e6576 uses Copper_copperRegion
pour e6578 uses Copper_copperRegion
pour e6580 uses Copper_copperRegion
pour e6582 uses Copper_copperRegion
pour e6584 uses Copper_copperRegion
pour e6586 uses Copper_copperRegion
pour e6588 uses Copper_copperRegion
pour e6590 uses Copper_copperRegion
pour e6592 uses Copper_copperRegion
pour e6594 uses Copper_copperRegion
pour e6596 uses Copper_copperRegion
pour e6598 uses Copper_copperRegion
pour e6600 uses Copper_copperRegion
pour e6603 uses Copper_copperRegion
pour e6605 uses Copper_copperRegion
pour e6607 uses Copper_copperRegion
pour e6609 uses Copper_copperRegion
pour e6611 uses Copper_copperRegion
pour e6613 uses Copper_copperRegion
pour e6615 uses Copper_copperRegion
pour e6617 uses Copper_copperRegion
pour e6619 uses Copper_copperRegion
pour e6621 uses Copper_copperRegion
pour e6623 uses Copper_copperRegion
pour e6625 uses Copper_copperRegion
pour e6627 uses Copper_copperRegion
pour e6629 uses Copper_copperRegion
pour e6631 uses Copper_copperRegion
pour e6633 uses Copper_copperRegion
pour e6635 uses Copper_copperRegion
pour e6637 uses Copper_copperRegion
pour e6639 uses Copper_copperRegion
pour e6641 uses Copper_copperRegion
pour e6643 uses Copper_copperRegion
pour e6645 uses Copper_copperRegion
pour e6647 uses Copper_copperRegion
pour e6649 uses Copper_copperRegion
pour e6651 uses Copper_copperRegion
pour e6653 uses Copper_copperRegion
pour e6655 uses Copper_copperRegion
pour e6657 uses Copper_copperRegion
pour e6659 uses Copper_copperRegion
pour e6661 uses Copper_copperRegion
pour e6663 uses Copper_copperRegion
pour e6665 uses Copper_copperRegion
pour e6667 uses Copper_copperRegion
pour e6669 uses Copper_copperRegion
pour e6671 uses Copper_copperRegion
pour e6673 uses Copper_copperRegion
pour e6675 uses Copper_copperRegion
pour e6677 uses Copper_copperRegion
pour e6679 uses Copper_copperRegion
pour e6681 uses Copper_copperRegion
pour e6683 uses Copper_copperRegion
pour e6685 uses Copper_copperRegion
pour e6687 uses Copper_copperRegion
pour e6689 uses Copper_copperRegion
pour e6691 uses Copper_copperRegion
pour e6693 uses Copper_copperRegion
pour e6695 uses Copper_copperRegion
pour e6697 uses Copper_copperRegion
pour e6699 uses Copper_copperRegion
pour e6701 uses Copper_copperRegion
pour e6703 uses Copper_copperRegion
pour e6705 uses Copper_copperRegion
pour e6707 uses Copper_copperRegion
pour e6709 uses Copper_copperRegion
pour e6711 uses Copper_copperRegion
pour e6713 uses Copper_copperRegion
pour e6715 uses Copper_copperRegion
pour e6717 uses Copper_copperRegion
pour e6719 uses Copper_copperRegion
pour e6721 uses Copper_copperRegion
pour e6723 uses Copper_copperRegion
pour e6725 uses Copper_copperRegion
pour e6727 uses Copper_copperRegion
pour e6729 uses Copper_copperRegion
pour e6731 uses Copper_copperRegion
pour e6742 uses Copper_copperRegion
pour e6744 uses Copper_copperRegion
pour e6746 uses Copper_copperRegion
pour e6748 uses Copper_copperRegion
pour e6750 uses Copper_copperRegion
pour e6752 uses Copper_copperRegion
pour e6754 uses Copper_copperRegion
pour e6756 uses Copper_copperRegion
pour e6758 uses Copper_copperRegion
pour e6760 uses Copper_copperRegion
pour e6762 uses Copper_copperRegion
pour e6764 uses Copper_copperRegion
pour e6766 uses Copper_copperRegion
pour e6768 uses Copper_copperRegion

## Placement (name value [footprint] x y rotation side)
ANT1  CA-C03  [ANT-SMD_CA-C03]  19.94 2.16 0 top
AUDIO1  Audio_PJ-3220  [AUDIO_JACK_PJ-3220-Y]  9.48 11.24 90 top
B1  120R@100MHz  [R0201]  58.06 30.6 270 bottom
B2  120R@100MHz  [R0201]  59.37 29.3 270 bottom
B3  120R@100MHz  [R0201]  58.06 25.4 90 bottom
B4  120R@100MHz  [R0201]  54.81 27.35 90 bottom
B5  220R@100MHz  [r0402]  28.66 33.21 180 top
B6  220R@100MHz  [r0402]  24.18 44.47 90 bottom
C1  12pF  [c0402]  54.95 16.32 0 bottom
C2  12pF  [c0402]  52.41 16.32 0 bottom
C3  12pF  [c0402]  61.8 16.06 270 bottom
C4  12pF  [c0402]  59.26 18.09 0 bottom
C5  100nF  [c0402]  76.2 19.94 270 top
C6  100nF  [C0201]  59.37 24.75 90 bottom
C7  100nF  [C0201]  60.66 24.74 270 bottom
C8  100nF  [c0402]  64.72 24.44 270 bottom
C9  4.7uF  [c0402]  64.72 25.33 270 bottom
C10  100nF  [c0402]  64.72 26.22 270 bottom
C11  100nF  [C0201]  54.81 31.25 90 bottom
C12  100nF  [C0201]  58.06 31.25 270 bottom
C13  100nF  [C0201]  60.66 27.35 270 bottom
C14  100nF  [C0201]  60.66 26.05 270 bottom
C15  100nF  [C0201]  60.66 28.65 270 bottom
C16  22uF/10V  [c0603]  32.97 24.32 90 bottom
C17  22uF/10V  [c0603]  32.97 32.45 90 bottom
C18  4.7uF  [c0402]  32.97 26.48 90 bottom
C19  4.7uF  [c0402]  32.97 29.52 90 bottom
C20  100nF  [c0402]  32.92 28 90 bottom
C21  100nF  [c0402]  32.97 24.19 270 top
C22  100nF  [c0402]  32.97 31.81 270 top
C23  100nF  [c0402]  46.44 24.19 90 top
C24  100nF  [c0402]  46.44 31.81 90 top
C25  100nF  [C0201]  41.56 30.28 180 bottom
C26  100nF  [C0201]  38.36 30.28 180 bottom
C27  100nF  [C0201]  38.36 25.08 180 bottom
C28  100nF  [C0201]  35.16 31.58 180 bottom
C29  100nF  [c0402]  47.49 29.48 270 bottom
C30  22uF/10V  [c0603]  32.97 22.92 90 bottom
C31  4.7uF  [c0402]  42.25 20 270 bottom
C32  100nF  [C0201]  42.35 34.17 0 bottom
C33  100nF  [C0201]  40.76 34.17 0 bottom
C34  100nF  [C0201]  39.16 34.17 180 bottom
C35  100nF  [C0201]  37.56 34.17 180 bottom
C36  100nF  [C0201]  39.16 24.42 180 bottom
C37  100nF  [C0201]  40.76 24.42 0 bottom
C38  100nF  [C0201]  39.16 32.88 180 bottom
C39  100nF  [C0201]  40.76 32.88 0 bottom
C40  100nF  [C0201]  35.16 32.88 180 bottom
C41  100nF  [C0201]  37.56 31.57 180 bottom
C42  100nF  [C0201]  39.16 31.61 0 bottom
C43  100nF  [C0201]  39.16 29.62 180 bottom
C44  100nF  [C0201]  40.76 31.58 180 bottom
C45  100nF  [C0201]  42.35 31.58 180 bottom
C46  100nF  [C0201]  35.16 30.28 180 bottom
C47  100nF  [c0402]  50.03 28.98 0 bottom
C48  100nF  [C0201]  53.17 26.98 180 bottom
C49  22uF/10V  [c0603]  32.97 33.84 90 bottom
C50  4.7uF  [c0402]  42.25 35.37 270 bottom
C51  100nF  [C0201]  37.56 21.83 180 bottom
C52  100nF  [C0201]  35.16 28.98 180 bottom
C53  100nF  [C0201]  37.56 28.98 0 bottom
C54  100nF  [C0201]  35.95 28.98 0 bottom
C55  100nF  [C0201]  40.76 29.62 180 bottom
C56  100nF  [C0201]  36.36 27.35 90 bottom
C57  100nF  [C0201]  43.16 28.98 180 bottom
C58  100nF  [C0201]  44.76 28.98 180 bottom
C59  100nF  [C0201]  35.16 26.38 180 bottom
C60  100nF  [C0201]  39.16 26.45 0 bottom
C61  100nF  [C0201]  42.76 26.7 90 bottom
C62  100nF  [C0201]  35.16 25.08 180 bottom
C63  100nF  [C0201]  37.56 25.08 0 bottom
C64  100nF  [c0402]  45.8 25.97 0 top
C65  100nF  [c0402]  45.8 30.03 0 top
C66  100nF  [c0402]  34.12 25.97 0 top
C67  100nF  [c0402]  34.12 30.03 180 top
C68  100nF  [c0402]  45.8 33.59 180 top
C69  100nF  [c0402]  45.8 22.41 0 top
C70  100nF  [c0402]  34.12 22.41 0 top
C71  100nF  [c0402]  34.12 33.59 0 top
C72  100nF  [C0201]  35.16 23.12 0 bottom
C73  100nF  [C0201]  38.76 20.85 270 bottom
C74  100nF  [C0201]  39.16 21.83 180 bottom
C75  100nF  [C0201]  41.16 20.85 90 bottom
C76  100nF  [C0201]  40.76 21.83 0 bottom
C77  100nF  [C0201]  40.76 23.12 0 bottom
C78  100nF  [C0201]  39.16 23.12 180 bottom
C79  4.7uF  [c0402]  39.83 42.99 180 bottom
C80  4.7uF  [c0402]  45.42 39.18 270 bottom
C81  10uF  [c0402]  45.42 40.19 270 bottom
C82  4.7uF  [c0402]  44.15 42.99 180 bottom
C83  4.7uF  [c0402]  43.26 39.18 270 bottom
C84  10uF  [c0402]  43.26 40.19 270 bottom
C85  100nF  [c0402]  37.42 40.45 270 top
C86  4.7uF  [c0402]  35.52 42.99 180 bottom
C87  4.7uF  [c0402]  40.34 39.68 0 bottom
C88  100nF  [c0402]  41.36 39.68 0 bottom
C89  100nF  [C0201]  59.04 30.92 0 bottom
C90  100nF  [C0201]  59.37 29.95 90 bottom
C91  100nF  [C0201]  59.69 30.92 180 bottom
C92  100nF  [C0201]  60.66 29.3 90 bottom
C93  4.7uF  [c0402]  58.39 22.15 180 bottom
C94  100nF  [C0201]  56.77 26.7 90 bottom
C95  100nF  [C0201]  59.37 28.65 270 bottom
C96  100nF  [C0201]  59.37 28 270 bottom
C97  100nF  [C0201]  59.37 27.35 270 bottom
C98  100nF  [C0201]  59.37 26.7 270 bottom
C99  100nF  [C0201]  59.37 26.05 270 bottom
C100  100nF  [C0201]  59.37 25.4 270 bottom
C101  100nF  [C0201]  58.06 29.95 270 bottom
C102  100nF  [C0201]  58.06 29.3 270 bottom
C103  100nF  [C0201]  58.06 28.65 270 bottom
C104  100nF  [C0201]  58.06 28 270 bottom
C105  100nF  [C0201]  58.06 27.35 270 bottom
C106  100nF  [C0201]  58.06 26.7 90 bottom
C107  100nF  [C0201]  58.06 26.05 90 bottom
C108  100nF  [C0201]  56.77 26.05 90 bottom
C109  100nF  [C0201]  56.77 29.95 270 bottom
C110  100nF  [C0201]  56.77 29.3 270 bottom
C111  100nF  [C0201]  56.77 28.65 270 bottom
C112  100nF  [C0201]  56.77 28 270 bottom
C113  100nF  [C0201]  56.77 27.35 90 bottom
C114  4.7uF  [c0402]  45.96 28.98 180 bottom
C115  100nF  [C0201]  54.81 26.7 90 bottom
C116  100nF  [C0201]  54.81 28.65 90 bottom
C117  100nF  [C0201]  54.81 29.3 90 bottom
C118  100nF  [C0201]  54.81 28 90 bottom
C119  100nF  [C0201]  54.81 26.05 90 bottom
C120  22uF/10V  [c0603]  82.42 43.81 270 bottom
C121  22uF/10V  [c0603]  82.42 42.42 270 bottom
C122  22uF/10V  [c0603]  56.64 12.06 180 top
C123  22uF/10V  [c0603]  58.04 12.06 180 top
C124  47pF  [c0402]  54.1 10.03 90 top
C125  22uF/10V  [c0603]  60.83 12.06 180 top
C126  22uF/10V  [c0603]  62.23 12.06 180 top
C127  22uF/10V  [c0603]  59.44 12.06 180 top
C128  NC  [c0402]  54.1 6.98 90 top
C129  22uF/10V  [c0603]  44.2 12.06 180 top
C130  22uF/10V  [c0603]  45.59 12.06 180 top
C131  47pF  [c0402]  41.66 10.03 90 top
C132  22uF/10V  [c0603]  46.99 12.06 180 top
C133  22uF/10V  [c0603]  48.39 12.06 180 top
C134  22uF/10V  [c0603]  49.78 12.06 180 top
C135  100nF  [c0402]  41.66 6.98 90 top
C136  22uF/10V  [c0603]  80.39 30.1 0 top
C137  22uF/10V  [c0603]  78.99 30.1 0 top
C138  47pF  [c0402]  83.06 31.62 270 top
C139  22uF/10V  [c0603]  77.6 30.1 0 top
C140  22uF/10V  [c0603]  76.2 30.1 0 top
C141  22uF/10V  [c0603]  74.8 30.1 0 top
C142  100nF  [c0402]  83.06 33.91 270 top
C143  22uF/10V  [c0603]  80.39 22.73 0 top
C144  22uF/10V  [c0603]  78.99 22.73 0 top
C145  47pF  [c0402]  83.06 24.26 270 top
C146  22uF/10V  [c0603]  77.6 22.73 0 top
C147  22uF/10V  [c0603]  76.2 22.73 0 top
C148  22uF/10V  [c0603]  74.8 22.73 0 top
C149  100nF  [C0201]  56.77 25.4 90 bottom
C150  100nF  [c0402]  83.06 26.54 270 top
C151  100nF  [C0201]  53.84 27.67 0 bottom
C152  100nF  [C0201]  57.74 23.78 180 bottom
C153  100nF  [C0201]  58.39 23.78 180 bottom
C154  100nF  [C0201]  54.81 25.4 90 bottom
C155  100nF  [C0201]  57.43 24.74 270 bottom
C156  100nF  [C0201]  59.37 24.1 90 bottom
C157  100nF  [C0201]  54.84 24.77 90 bottom
C158  100nF  [C0201]  56.16 24.11 270 bottom
C159  4.7uF  [c0402]  75.56 37.21 0 top
C160  22uF/10V  [c0603]  82.42 45.34 270 bottom
C161  22uF/10V  [c0603]  82.42 46.74 270 bottom
C162  4.7uF  [c0402]  20.02 16.32 270 top
C163  NC  [c0402]  18.37 15.81 0 top
C164  100nF  [c0402]  73.28 33.16 180 top
C165  4.7uF  [c0402]  20.02 15.3 270 top
C166  47uF  [C1206]  24.89 16 180 bottom
C167  47uF  [C1206]  24.89 13.46 180 bottom
C168  4.7uF  [c0402]  70.36 33.15 0 top
C169  4.7uF  [c0402]  82.3 11.45 270 bottom
C170  4.7uF  [c0402]  82.3 12.84 90 bottom
C171  4.7uF  [c0402]  26.67 11.05 0 bottom
C172  10nF  [c0402]  24.64 11.05 180 bottom
C173  4.7uF  [c0402]  65.53 15.51 270 top
C174  NC/12pF  [c0402]  29.97 14.1 180 bottom
C175  NC/12pF  [c0402]  34.04 14.1 0 bottom
C176  4.7uF  [c0402]  32.38 10.92 0 bottom
C177  100nF  [c0402]  31.37 10.92 0 bottom
C178  4.7uF  [c0402]  36.15 17.2 180 bottom
C179  100nF  [c0402]  37.17 17.2 180 bottom
C180  NC/4.7uF  [c0402]  36.66 19.87 270 bottom
C181  NC/100nF  [c0402]  36.66 18.86 270 bottom
C182  100nF  [c0402]  23.58 33.21 0 top
C183  4.7uF  [c0402]  24.18 40.4 270 bottom
C184  4.7uF  [c0402]  29.67 33.21 0 top
C185  100nF  [c0402]  30.69 33.21 0 top
C186  4.7uF  [c0402]  26.62 33.21 0 top
C187  100nF  [c0402]  27.81 46.48 0 bottom
C188  12pF  [c0402]  14.48 48.39 180 top
C189  12pF  [c0402]  17.02 50.55 270 top
C190  4.7uF  [c0402]  24.18 42.43 270 bottom
C191  100nF  [c0402]  24.18 43.45 270 bottom
C192  4.7uF  [c0402]  27.64 30.79 180 top
C193  100nF  [c0402]  27.64 33.21 0 top
C194  100nF  [c0402]  28.83 46.48 0 bottom
C195  10nF  [c0402]  26.42 19.18 270 bottom
C196  10nF  [c0402]  26.42 18.16 270 bottom
C197  1000pF  [C1206]  15.45 32.57 180 bottom
C198  4.7uF  [c0402]  30.69 27.24 90 top
C199  100nF  [c0402]  30.69 26.22 90 top
C200  12pF  [c0402]  20.53 26.35 270 top
C201  12pF  [c0402]  20.53 31.3 90 top
C202  4.7uF  [c0402]  20.53 23.3 270 top
C203  100nF  [c0402]  26.62 30.79 180 top
C204  100nF  [c0402]  30.69 25.21 90 top
C205  4.7uF  [c0402]  24.59 30.79 180 top
C206  100nF  [c0402]  20.53 25.33 270 top
C207  100nF  [c0402]  30.69 24.19 90 top
C208  100nF  [c0402]  23.58 30.79 180 top
C209  4.7uF  [c0402]  30.69 29.27 90 top
C210  100nF  [c0402]  30.69 28.25 90 top
CAMERA1  -  [BTB-DF30FC-24DS-0.4V(81)]  42.5 41.46 270 top
D1  B0520WS  [SOD-523]  47.58 38.41 0 top
D2  B0520WS  [SOD-523]  37.42 38.41 180 top
D3  ESD5B5.0ST1G  [SOD-523]  72.14 17.02 90 bottom
D4  WS2812B_mini  [LED-SMD_4P-L3.5-W3.5-TL_WS2812B]  72.52 48.64 180 top
D5  B0520WS  [SOD-523]  72.47 45.78 0 top
D6  ESD5B5.0ST1G  [SOD-523]  66.88 28.25 180 bottom
D7  ESD5B5.0ST1G  [SOD-523]  66.88 29.27 180 bottom
D8  ESD5B5.0ST1G  [SOD-523]  66.88 32.45 180 bottom
D9  ESD5B5.0ST1G  [SOD-523]  66.88 33.46 180 bottom
D10  ESD5B5.0ST1G  [SOD-523]  66.88 26.22 180 bottom
D11  ESD5B5.0ST1G  [SOD-523]  66.88 27.24 180 bottom
D12  B0520WS  [SOD-523]  15.42 45.47 270 top
D13  B0520WS  [SOD-523]  14.28 45.47 270 top
FPC1  FPC-05F-22PH20  [fpc-smd_22p-p0.50_fpc-05f-22ph20]  57.5 51 180 top
FPC2  FPC-05F-22PH20  [fpc-smd_22p-p0.50_fpc-05f-22ph20#2]  27.5 51 180 top
HDMI1  HDMI-MH  [HDMI]  8.5 41 0 top
J1  FPC0.3-SMT-31P  [FPC0.3-FH26W-31S-0.3SHW]  9.5 41 0 bottom
J2  -  [USB_TYPE_C]  80.5 44 90 top
J3  -  [USB_TYPE_C]  80.5 12 90 top
JP1  HEADER_20X2_H  [HEADER_2x20_H_F_2.54MM]  52.5 3.5 270 top
L1  2.2uH/&gt;2A  [3015]  60.96 8.38 0 top
L2  2.2uH/&gt;2A  [3015]  48.51 8.38 0 top
L3  4.7uH/&gt;2A  [3015]  76.07 33.66 180 top
L4  2.2uH/&gt;2A  [3015]  76.07 26.29 180 top
L5  3nH  [r0402]  24.47 5.72 0 top
L6  NC/4.7uH  [252012_NSK]  32.44 18.54 90 bottom
MIC1  B4012AP422-003  [MIC-TH_BD4.0-P1.40-D0.3-L]  9.98 3.15 0 top
NOREF  -  [Pad_e1008]  81.5 52.5 270 top
NOREF#2  -  [Pad_e1011]  19.5 43.5 0 top
NOREF#3  -  [Pad_e1013]  67.5 10.5 0 top
NOREF#4  -  [Pad_e1012]  19.5 10.5 0 top
NOREF#5  -  [Pad_e1007]  3.5 52.5 270 top
NOREF#6  -  [Pad_e1006]  3.5 3.5 0 top
NOREF#7  -  [Pad_e1009]  81.5 3.5 180 top
NOREF#8  -  [Pad_e1010]  67.5 43.5 0 top
PWR1  LED  [0603_led_smt_nsk]  82.8 37.59 180 top
Q1  BSS138  [SOT-23-3_L2.9-W1.3-P1.90-LS2.4-BR]  74.55 17.02 180 bottom
R1  NC  [r0402]  60.31 20.36 90 bottom
R2  10k  [r0402]  63.2 19.11 0 top
R3  200R  [r0402]  64.72 22.67 270 bottom
R4  200R  [r0402]  64.72 23.56 270 bottom
R5  30k  [r0402]  61.17 17.97 270 top
R6  30k  [r0402]  61.17 18.98 270 top
R7  100k  [r0402]  76.2 18.8 90 top
R8  10k  [r0402]  69.3 16.44 180 bottom
R9  10k  [r0402]  69.3 18.6 0 bottom
R10  10k  [r0402]  56.5 21.32 90 bottom
R11  NC  [r0402]  70.31 16.44 0 bottom
R12  NC  [r0402]  70.31 18.6 180 bottom
R13  0R  [r0402]  35.96 31.17 0 bottom
R14  240R  [r0402]  49.81 28.91 180 top
R15  0R  [r0402]  35.96 24.83 180 bottom
R16  240R  [r0402]  39.96 35.37 270 bottom
R17  1k  [r0402]  47.49 28.47 270 bottom
R18  1k  [r0402]  49.01 28.98 0 bottom
R19  10k  [r0402]  47.58 39.43 270 top
R20  10k  [r0402]  37.42 39.43 90 top
R21  10k  [r0402]  38.69 40.19 90 bottom
R22  10k  [r0402]  38.69 39.18 90 bottom
R23  200R  [r0402]  60.48 31.45 0 bottom
R24  10k  [r0402]  60.15 47.56 180 top
R25  0R  [r0402]  51.77 40.57 90 bottom
R26  4.7k  [r0402]  61.3 47.56 180 top
R27  NC  [r0402]  51.77 41.59 90 bottom
R28  4.7k  [r0402]  62.31 47.56 180 top
R29  4.7k  [r0402]  49.61 41.59 90 bottom
R30  4.7k  [r0402]  49.61 40.57 90 bottom
R31  10k  [r0402]  30.18 47.56 180 top
R32  4.7k  [r0402]  31.45 47.56 180 top
R33  4.7k  [r0402]  32.47 47.56 180 top
R34  10k  [r0402]  54.1 8 90 top
R35  33.2k  [r0402]  54.1 9.02 90 top
R36  100k  [r0402]  54.1 11.05 270 top
R37  10k  [r0402]  41.66 8 90 top
R38  100k  [r0402]  41.66 9.02 90 top
R39  100k  [r0402]  41.66 11.05 270 top
R40  1k  [r0402]  83.06 36.32 90 top
R41  10k  [r0402]  83.06 35.05 270 top
R42  300k  [r0402]  83.06 30.48 270 top
R43  66.5k  [r0402]  83.06 32.77 90 top
R44  10k  [r0402]  83.06 27.69 270 top
R45  200k  [r0402]  83.06 23.11 270 top
R46  100k  [r0402]  83.06 25.4 90 top
R47  4.7k  [r0402]  75.6 39.33 0 top
R48  4.7k  [r0402]  76.84 44.07 0 bottom
R49  4.7k  [r0402]  78.95 17.97 90 bottom
R50  2k  [r0402]  20.02 14.28 270 top
R51  10k  [r0402]  74.55 14.73 270 bottom
R52  2k  [r0402]  25.65 11.05 0 bottom
R53  2k  [r0402]  23.62 11.05 180 bottom
R54  10k  [r0402]  70.82 38.54 180 bottom
R55  0R  [r0402]  24.47 2.67 180 top
R56  0R  [r0402]  25.62 5.72 180 top
R57  10k  [r0402]  71.84 38.54 180 bottom
R58  10k  [r0402]  66.88 30.29 270 bottom
R59  10k  [r0402]  66.88 31.43 270 bottom
R60  10k  [r0402]  66.88 34.48 270 bottom
R61  10k  [r0402]  73.87 38.54 180 bottom
R62  10k  [r0402]  72.85 38.54 180 bottom
R63  10k  [r0402]  37.21 15.49 270 top
R64  10k  [r0402]  37.21 14.61 270 top
R65  NC  [r0402]  37.21 13.72 270 top
R66  10k  [r0402]  37.21 12.83 270 top
R67  10k  [r0402]  37.21 11.94 270 top
R68  10k  [r0402]  37.21 11.05 270 top
R69  10k  [r0402]  37.21 10.16 270 top
R70  100k  [r0402]  25.53 46.48 180 bottom
R71  10k  [r0402]  24.51 46.48 180 bottom
R72  10k  [r0402]  23.5 46.48 180 bottom
R73  10k  [r0402]  15.42 43.06 180 top
R74  10k  [r0402]  22.56 33.21 180 top
R75  10k  [r0402]  26.54 46.48 180 bottom
R76  10k  [r0402]  24.59 33.21 180 top
R77  10k  [r0402]  25.61 33.21 180 top
R78  10k  [r0402]  21.55 33.21 180 top
R79  2k  [r0402]  24.18 41.42 270 bottom
R80  1M  [r0402]  19.69 48.39 180 top
R81  2.49k  [r0402]  20.53 24.32 90 top
R82  1k  [r0402]  20.53 33.21 0 top
R83  1k  [r0402]  20.02 19.24 90 top
R84  10k  [r0402]  22.56 30.79 0 top
R85  10k  [r0402]  25.61 30.79 0 top
R86  75R  [R0603]  20.28 32.45 0 bottom
R87  75R  [R0603]  18.75 32.45 0 bottom
R88  75R  [R0603]  21.8 32.45 0 bottom
R89  75R  [R0603]  23.32 32.45 0 bottom
R90  0R  [R0603]  15.45 33.97 90 top
SW1  TS-1185-B-A-B-A  [SW-SMD_L4.0-W3.0-LS5.0]  81.28 19.3 180 top
SW2  TS36CA-0.6 250gf 031  [SW-SMD_SHOU_TS36CA-0.6]  72.5 53.5 180 top
SW3  TS36CA-0.6 250gf 031  [SW-SMD_SHOU_TS36CA-0.6]  12.5 53.5 180 top
T1  TestPoint  [TestPoint_D30]  28.74 43.67 180 bottom
U1  XC6206-2.8V  [SOT23-3]  46.31 42.99 180 bottom
U2  -  [CAM_OV5647]  42.5 51.96 0 top
U3  XC6206-2.8V  [SOT23-3]  41.99 42.99 180 bottom
U4  XC6206-1.5V  [SOT23-3]  37.67 42.99 180 bottom
U5  TLV62569  [SOT23-5]  57.15 8.38 0 top
U6  TLV62569  [SOT23-5]  44.7 8.38 0 top
U7  TLV62569  [SOT23-5]  79.95 33.66 180 top
U8  TLV62569  [SOT23-5]  79.95 26.29 180 top
U9  XC6206P182MR  [SOT-23-3_L3.0-W1.7-P0.95-LS2.9-BR]  77.98 37.21 180 top
U10  MT9700  [SOT-23-5_L3.0-W1.7-P0.95-LS2.8-BR]  79.12 44.07 270 bottom
U11  CH342K  [ESSOP-10-EP]  71.71 37.91 270 top
U12  PRTR5V0U2X  [SOT143L]  73.53 12 270 bottom
U13  MT9700  [SOT-23-5_L3.0-W1.7-P0.95-LS2.8-BR]  79.12 12.19 270 bottom
U14  TL8821/TL8189  [qfn44-0.9mm-12x12mm]  29.21 13.72 90 top
U15  TF卡座  [TF2]  74.5 28 180 bottom
U16  TPD4E05U06  [DFN_2510_10]  17.27 36.61 180 top
U17  TPD4E05U06  [DFN_2510_10]  17.27 39.61 180 top
U18  LT9611  [QFN_64_7P5X7P5_0P4]  27.94 39.62 270 top
U19  Magnetics_10/100_BaseT  [MAGNETICS_10/100_BASET]  19 24 180 bottom
U20  RJ45-8P  [RJ45_RC01812]  12 24 90 top
U21  RTL8152B-VB-CG  [QFN_24]  24.97 26.09 90 top
U22  K230_LP4  [K230]  57.74 28 180 top
U23  K4F8E304HB-MGCJ  [BGA-200_L15.0-W10.0_K4F8E304HB-MGCJ]  39.96 28 0 top
Y1  32.768khz  [CRYSTAL-SMD_L3.2-W1.5_RT3215]  53.68 18.6 0 bottom
Y2  24Mhz±10ppm  [XTAL_3225]  61.8 18.09 0 bottom
Y3  NC/26Mhz±10ppm  [XTAL_3225]  32 14.1 270 bottom
Y4  27Mhz  [XTAL_3225]  17.02 48.39 0 top
Y5  25MHz  [XTAL_3225]  20.53 28.76 270 top

## Footprints (pads in the part's own frame, mm; a bottom-side part is the same pattern mirrored in y, then rotated)
0603_led_smt_nsk
  rect 0.965x0.787 hole 0.001: 1(-0.787,0) 2(0.787,0)
3015
  rect 0.9x2.7 hole 0.001: 1(-1.15,0) 2(1.15,0)
252012_NSK
  rect 0.85x2 hole 0.001: 1(-0.825,0) 2(0.825,0)
ANT-SMD_CA-C03
  rect 1.5x2.3 hole 0.001: 1(-2.65,0) 2(2.65,0)
AUDIO_JACK_PJ-3220-Y
  oval 2.5x1.5 hole 1.5x0.8: 1(0,-4.45)
  oval 1.5x2.5 hole 0.8x1.5: 2(2.85,-3.55) 3(-3.4,4.45) 3(3.4,4.45) 4(-2.85,-3.55)
BGA-200_L15.0-W10.0_K4F8E304HB-MGCJ
  round 0.254 hole 0.001: A1(-4.4,6.825) A2(-3.6,6.825) A3(-2.8,6.825) A4(-2,6.825) A5(-1.2,6.825) A8(1.2,6.825) A9(2,6.825) A10(2.8,6.825) A11(3.6,6.825) A12(4.4,6.825) AA1(-4.4,-6.175) AA2(-3.6,-6.175) AA3(-2.8,-6.175) AA4(-2,-6.175) AA5(-1.2,-6.175) AA8(1.2,-6.175) AA9(2,-6.175) AA10(2.8,-6.175) AA11(3.6,-6.175) AA12(4.4,-6.175) AB1(-4.4,-6.825) AB2(-3.6,-6.825) AB3(-2.8,-6.825) AB4(-2,-6.825) AB5(-1.2,-6.825) AB8(1.2,-6.825) AB9(2,-6.825) AB10(2.8,-6.825) AB11(3.6,-6.825) AB12(4.4,-6.825) B1(-4.4,6.175) B2(-3.6,6.175) B3(-2.8,6.175) B4(-2,6.175) B5(-1.2,6.175) B8(1.2,6.175) B9(2,6.175) B10(2.8,6.175) B11(3.6,6.175) B12(4.4,6.175) C1(-4.4,5.525) C2(-3.6,5.525) C3(-2.8,5.525) C4(-2,5.525) C5(-1.2,5.525) C8(1.2,5.525) C9(2,5.525) C10(2.8,5.525) C11(3.6,5.525) C12(4.4,5.525) D1(-4.4,4.875) D2(-3.6,4.875) D3(-2.8,4.875) D4(-2,4.875) D5(-1.2,4.875) D8(1.2,4.875) D9(2,4.875) D10(2.8,4.875) D11(3.6,4.875) D12(4.4,4.875) E1(-4.4,4.225) E2(-3.6,4.225) E3(-2.8,4.225) E4(-2,4.225) E5(-1.2,4.225) E8(1.2,4.225) E9(2,4.225) E10(2.8,4.225) E11(3.6,4.225) E12(4.4,4.225) F1(-4.4,3.575) F2(-3.6,3.575) F3(-2.8,3.575) F4(-2,3.575) F5(-1.2,3.575) F8(1.2,3.575) F9(2,3.575) F10(2.8,3.575) F11(3.6,3.575) F12(4.4,3.575) G1(-4.4,2.925) G2(-3.6,2.925) G3(-2.8,2.925) G4(-2,2.925) G5(-1.2,2.925) G8(1.2,2.925) G9(2,2.925) G10(2.8,2.925) G11(3.6,2.925) G12(4.4,2.925) H1(-4.4,2.275) H2(-3.6,2.275) H3(-2.8,2.275) H4(-2,2.275) H5(-1.2,2.275) H8(1.2,2.275) H9(2,2.275) H10(2.8,2.275) H11(3.6,2.275) H12(4.4,2.275) J1(-4.4,1.625) J2(-3.6,1.625) J3(-2.8,1.625) J4(-2,1.625) J5(-1.2,1.625) J8(1.2,1.625) J9(2,1.625) J10(2.8,1.625) J11(3.6,1.625) J12(4.4,1.625) K1(-4.4,0.975) K2(-3.6,0.975) K3(-2.8,0.975) K4(-2,0.975) K5(-1.2,0.975) K8(1.2,0.975) K9(2,0.975) K10(2.8,0.975) K11(3.6,0.975) K12(4.4,0.975) N1(-4.4,-0.975) N2(-3.6,-0.975) N3(-2.8,-0.975) N4(-2,-0.975) N5(-1.2,-0.975) N8(1.2,-0.975) N9(2,-0.975) N10(2.8,-0.975) N11(3.6,-0.975) N12(4.4,-0.975) P1(-4.4,-1.625) P2(-3.6,-1.625) P3(-2.8,-1.625) P4(-2,-1.625) P5(-1.2,-1.625) P8(1.2,-1.625) P9(2,-1.625) P10(2.8,-1.625) P11(3.6,-1.625) P12(4.4,-1.625) R1(-4.4,-2.275) R2(-3.6,-2.275) R3(-2.8,-2.275) R4(-2,-2.275) R5(-1.2,-2.275) R8(1.2,-2.275) R9(2,-2.275) R10(2.8,-2.275) R11(3.6,-2.275) R12(4.4,-2.275) T1(-4.4,-2.925) T2(-3.6,-2.925) T3(-2.8,-2.925) T4(-2,-2.925) T5(-1.2,-2.925) T8(1.2,-2.925) T9(2,-2.925) T10(2.8,-2.925) T11(3.6,-2.925) T12(4.4,-2.925) U1(-4.4,-3.575) U2(-3.6,-3.575) U3(-2.8,-3.575) U4(-2,-3.575) U5(-1.2,-3.575) U8(1.2,-3.575) U9(2,-3.575) U10(2.8,-3.575) U11(3.6,-3.575) U12(4.4,-3.575) V1(-4.4,-4.225) V2(-3.6,-4.225) V3(-2.8,-4.225) V4(-2,-4.225) V5(-1.2,-4.225) V8(1.2,-4.225) V9(2,-4.225) V10(2.8,-4.225) V11(3.6,-4.225) V12(4.4,-4.225) W1(-4.4,-4.875) W2(-3.6,-4.875) W3(-2.8,-4.875) W4(-2,-4.875) W5(-1.2,-4.875) W8(1.2,-4.875) W9(2,-4.875) W10(2.8,-4.875) W11(3.6,-4.875) W12(4.4,-4.875) Y1(-4.4,-5.525) Y2(-3.6,-5.525) Y3(-2.8,-5.525) Y4(-2,-5.525) Y5(-1.2,-5.525) Y8(1.2,-5.525) Y9(2,-5.525) Y10(2.8,-5.525) Y11(3.6,-5.525) Y12(4.4,-5.525)
BTB-DF30FC-24DS-0.4V(81)
  rect 0.8x0.23 hole 0.001: 1(-2.08,2.2) 2(-2.08,1.8) 3(-2.08,1.4) 4(-2.08,1) 5(-2.08,0.6) 6(-2.08,0.2) 7(-2.08,-0.2) 8(-2.08,-0.6) 9(-2.08,-1) 10(-2.08,-1.4) 11(-2.08,-1.8) 12(-2.08,-2.2) 13(2.08,-2.2) 14(2.08,-1.8) 15(2.08,-1.4) 16(2.08,-1) 17(2.08,-0.6) 18(2.08,-0.2) 19(2.08,0.2) 20(2.08,0.6) 21(2.08,1) 22(2.08,1.4) 23(2.08,1.8) 24(2.08,2.2)
C0201
  rect 0.305x0.305 hole 0.001: 1(0,0.305) 2(0,-0.305)
c0402
  custom 0.508x0.635 hole 0.001: 1(0,0.508) 2(0,-0.508)
c0603
  rect 0.762x0.889 hole 0.001: 1(0,0.762) 2(0,-0.762)
C1206
  rect 1.524x1.6 hole 0.001: 1(-1.3,0) 2(1.3,0)
CRYSTAL-SMD_L3.2-W1.5_RT3215
  rect 1.05x1.7 hole 0.001: 1(-1.27,0) 2(1.27,0)
DFN_2510_10
  rect 0.686x0.203 hole 0.001: 1(-0.432,1) 2(-0.432,0.5) 4(-0.432,-0.5) 5(-0.432,-1) 6(0.432,-1) 7(0.432,-0.5) 9(0.432,0.5) 10(0.432,1)
  rect 0.686x0.381 hole 0.001: 3(-0.432,0) 8(0.432,0)
ESSOP-10-EP
  oval 1.524x0.508 hole 0.001: 1(-2.667,2) 2(-2.667,1) 3(-2.667,0) 4(-2.667,-1) 5(-2.667,-2) 6(2.667,-2) 7(2.667,-1) 8(2.667,0) 9(2.667,1) 10(2.667,2)
  rect 2.1x3.3 hole 0.001: 11(0,0)
FPC0.3-FH26W-31S-0.3SHW
  rect 0.8x0.3 hole 0.001: 1(-1.6,4.5) 2(1.6,4.2) 3(-1.6,3.9) 4(1.6,3.6) 5(-1.6,3.3) 6(1.6,3) 7(-1.6,2.7) 8(1.6,2.4) 9(-1.6,2.1) 10(1.6,1.8) 11(-1.6,1.5) 12(1.6,1.2) 13(-1.6,0.9) 14(1.6,0.6) 15(-1.6,0.3) 16(1.6,0) 17(-1.6,-0.3) 18(1.6,-0.6) 19(-1.6,-0.9) 20(1.6,-1.2) 21(-1.6,-1.5) 22(1.6,-1.8) 23(-1.6,-2.1) 24(1.6,-2.4) 25(-1.6,-2.7) 26(1.6,-3) 27(-1.6,-3.3) 28(1.6,-3.6) 29(-1.6,-3.9) 30(1.6,-4.2) 31(-1.6,-4.5)
  rect 1x0.5 hole 0.001: 32(-1.3,5.2) 33(-1.3,-5.2)
fpc-smd_22p-p0.50_fpc-05f-22ph20
  rect 0.3x1.5 hole 0.001: 1(-5.25,1.337) 2(-4.75,1.337) 3(-4.25,1.337) 4(-3.75,1.337) 5(-3.25,1.337) 6(-2.75,1.337) 7(-2.25,1.337) 8(-1.75,1.337) 9(-1.25,1.337) 10(-0.75,1.337) 11(-0.25,1.337) 12(0.25,1.337) 13(0.75,1.337) 14(1.25,1.337) 15(1.75,1.337) 16(2.25,1.337) 17(2.75,1.337) 18(3.25,1.337) 19(3.75,1.337) 20(4.25,1.337) 21(4.75,1.337) 22(5.25,1.337)
  rect 2x2.5 hole 0.001: 23(6.94,-1.337)
  rect 1.524x2.5 hole 0.001: 24(-6.94,-1.337)
fpc-smd_22p-p0.50_fpc-05f-22ph20#2
  rect 0.3x1.5 hole 0.001: 1(-5.25,1.337) 2(-4.75,1.337) 3(-4.25,1.337) 4(-3.75,1.337) 5(-3.25,1.337) 6(-2.75,1.337) 7(-2.25,1.337) 8(-1.75,1.337) 9(-1.25,1.337) 10(-0.75,1.337) 11(-0.25,1.337) 12(0.25,1.337) 13(0.75,1.337) 14(1.25,1.337) 15(1.75,1.337) 16(2.25,1.337) 17(2.75,1.337) 18(3.25,1.337) 19(3.75,1.337) 20(4.25,1.337) 21(4.75,1.337) 22(5.25,1.337)
  rect 2x2.5 hole 0.001: 23(6.94,-1.337)
  rect 1.524x2.5 hole 0.001: 24(-7.171,-1.337)
HDMI
  rect 2.5x0.3 hole 0.001: 1(3.745,-4.5)
  oval 2.5x0.3 hole 0.001: 2(3.745,-4) 3(3.745,-3.5) 4(3.745,-3) 5(3.745,-2.5) 6(3.745,-2) 7(3.745,-1.5) 8(3.745,-1) 9(3.745,-0.5) 10(3.745,0) 11(3.745,0.5) 12(3.745,1) 13(3.745,1.5) 14(3.745,2) 15(3.745,2.5) 16(3.745,3) 17(3.745,3.5) 18(3.745,4) 19(3.745,4.5)
  oval 2.7x1.5 hole 2.1x0.9: 20(-3.745,7.25) 21(-3.745,-7.25)
  oval 3.3x1.5 hole 2.7x0.9: 22(2.245,7.25) 23(2.245,-7.25)
HEADER_2x20_H_F_2.54MM
  rect 1.524x1.524 hole 0.889: 1(-1.27,24.13)
  round 1.524 hole 0.889: 2(1.27,24.13) 3(-1.27,21.59) 4(1.27,21.59) 5(-1.27,19.05) 6(1.27,19.05) 7(-1.27,16.51) 8(1.27,16.51) 9(-1.27,13.97) 10(1.27,13.97) 11(-1.27,11.43) 12(1.27,11.43) 13(-1.27,8.89) 14(1.27,8.89) 15(-1.27,6.35) 16(1.27,6.35) 17(-1.27,3.81) 18(1.27,3.81) 19(-1.27,1.27) 20(1.27,1.27) 21(-1.27,-1.27) 22(1.27,-1.27) 23(-1.27,-3.81) 24(1.27,-3.81) 25(-1.27,-6.35) 26(1.27,-6.35) 27(-1.27,-8.89) 28(1.27,-8.89) 29(-1.27,-11.43) 30(1.27,-11.43) 31(-1.27,-13.97) 32(1.27,-13.97) 33(-1.27,-16.51) 34(1.27,-16.51) 35(-1.27,-19.05) 36(1.27,-19.05) 37(-1.27,-21.59) 38(1.27,-21.59) 39(-1.27,-24.13) 40(1.27,-24.13)
K230
  round 0.28 hole 0.001: A2(-5.525,6.175) A3(-4.875,6.175) A4(-4.225,6.175) A5(-3.575,6.175) A6(-2.925,6.175) A7(-2.275,6.175) A8(-1.625,6.175) A9(-0.975,6.175) A10(-0.325,6.175) A11(0.325,6.175) A12(0.975,6.175) A13(1.625,6.175) A14(2.275,6.175) A15(2.925,6.175) A16(3.575,6.175) A17(4.225,6.175) A18(4.875,6.175) A19(5.525,6.175) A20(6.175,6.175) B1(-6.175,5.525) B2(-5.525,5.525) B3(-4.875,5.525) B4(-4.225,5.525) B5(-3.575,5.525) B6(-2.925,5.525) B7(-2.275,5.525) B8(-1.625,5.525) B9(-0.975,5.525) B10(-0.325,5.525) B11(0.325,5.525) B12(0.975,5.525) B13(1.625,5.525) B14(2.275,5.525) B15(2.925,5.525) B16(3.575,5.525) B17(4.225,5.525) B18(4.875,5.525) B19(5.525,5.525) B20(6.175,5.525) C1(-6.175,4.875) C2(-5.525,4.875) C3(-4.875,4.875) C4(-4.225,4.875) C5(-3.575,4.875) C6(-2.925,4.875) C7(-2.275,4.875) C8(-1.625,4.875) C9(-0.975,4.875) C10(-0.325,4.875) C11(0.325,4.875) C12(0.975,4.875) C13(1.625,4.875) C14(2.275,4.875) C15(2.925,4.875) C16(3.575,4.875) C17(4.225,4.875) C18(4.875,4.875) C19(5.525,4.875) C20(6.175,4.875) D1(-6.175,4.225) D2(-5.525,4.225) D3(-4.875,4.225) D4(-4.225,4.225) D5(-3.575,4.225) D6(-2.925,4.225) D7(-2.275,4.225) D8(-1.625,4.225) D9(-0.975,4.225) D10(-0.325,4.225) D11(0.325,4.225) D12(0.975,4.225) D13(1.625,4.225) D14(2.275,4.225) D15(2.925,4.225) D16(3.575,4.225) D17(4.225,4.225) D18(4.875,4.225) D19(5.525,4.225) D20(6.175,4.225) E1(-6.175,3.575) E2(-5.525,3.575) E3(-4.875,3.575) E4(-4.225,3.575) E6(-2.925,3.575) E7(-2.275,3.575) E8(-1.625,3.575) E9(-0.975,3.575) E10(-0.325,3.575) E11(0.325,3.575) E12(0.975,3.575) E13(1.625,3.575) E14(2.275,3.575) E15(2.925,3.575) E16(3.575,3.575) E17(4.225,3.575) E18(4.875,3.575) E19(5.525,3.575) E20(6.175,3.575) F1(-6.175,2.925) F2(-5.525,2.925) F3(-4.875,2.925) F4(-4.225,2.925) F6(-2.925,2.925) F7(-2.275,2.925) F8(-1.625,2.925) F9(-0.975,2.925) F10(-0.325,2.925) F11(0.325,2.925) F12(0.975,2.925) F13(1.625,2.925) F14(2.275,2.925) F15(2.925,2.925) F16(3.575,2.925) F17(4.225,2.925) F18(4.875,2.925) F19(5.525,2.925) F20(6.175,2.925) G1(-6.175,2.275) G2(-5.525,2.275) G3(-4.875,2.275) G4(-4.225,2.275) G5(-3.575,2.275) G6(-2.925,2.275) G7(-2.275,2.275) G8(-1.625,2.275) G9(-0.975,2.275) G10(-0.325,2.275) G11(0.325,2.275) G12(0.975,2.275) G13(1.625,2.275) G14(2.275,2.275) G15(2.925,2.275) G16(3.575,2.275) G17(4.225,2.275) G18(4.875,2.275) G19(5.525,2.275) G20(6.175,2.275) H1(-6.175,1.625) H2(-5.525,1.625) H3(-4.875,1.625) H4(-4.225,1.625) H5(-3.575,1.625) H6(-2.925,1.625) H7(-2.275,1.625) H8(-1.625,1.625) H9(-0.975,1.625) H10(-0.325,1.625) H11(0.325,1.625) H12(0.975,1.625) H13(1.625,1.625) H14(2.275,1.625) H15(2.925,1.625) H16(3.575,1.625) H17(4.225,1.625) H18(4.875,1.625) H19(5.525,1.625) H20(6.175,1.625) J1(-6.175,0.975) J2(-5.525,0.975) J3(-4.875,0.975) J4(-4.225,0.975) J5(-3.575,0.975) J6(-2.925,0.975) J7(-2.275,0.975) J8(-1.625,0.975) J9(-0.975,0.975) J10(-0.325,0.975) J11(0.325,0.975) J12(0.975,0.975) J13(1.625,0.975) J14(2.275,0.975) J15(2.925,0.975) J16(3.575,0.975) J17(4.225,0.975) J18(4.875,0.975) J19(5.525,0.975) J20(6.175,0.975) K1(-6.175,0.325) K2(-5.525,0.325) K3(-4.875,0.325) K4(-4.225,0.325) K5(-3.575,0.325) K6(-2.925,0.325) K7(-2.275,0.325) K8(-1.625,0.325) K9(-0.975,0.325) K10(-0.325,0.325) K11(0.325,0.325) K12(0.975,0.325) K13(1.625,0.325) K14(2.275,0.325) K15(2.925,0.325) K16(3.575,0.325) K17(4.225,0.325) K18(4.875,0.325) K19(5.525,0.325) K20(6.175,0.325) L1(-6.175,-0.325) L2(-5.525,-0.325) L3(-4.875,-0.325) L4(-4.225,-0.325) L5(-3.575,-0.325) L6(-2.925,-0.325) L7(-2.275,-0.325) L8(-1.625,-0.325) L9(-0.975,-0.325) L10(-0.325,-0.325) L11(0.325,-0.325) L12(0.975,-0.325) L13(1.625,-0.325) L14(2.275,-0.325) L15(2.925,-0.325) L16(3.575,-0.325) L17(4.225,-0.325) L18(4.875,-0.325) L19(5.525,-0.325) L20(6.175,-0.325) M1(-6.175,-0.975) M2(-5.525,-0.975) M3(-4.875,-0.975) M4(-4.225,-0.975) M5(-3.575,-0.975) M6(-2.925,-0.975) M7(-2.275,-0.975) M8(-1.625,-0.975) M9(-0.975,-0.975) M10(-0.325,-0.975) M11(0.325,-0.975) M12(0.975,-0.975) M13(1.625,-0.975) M14(2.275,-0.975) M15(2.925,-0.975) M16(3.575,-0.975) M17(4.225,-0.975) M18(4.875,-0.975) M19(5.525,-0.975) M20(6.175,-0.975) N1(-6.175,-1.625) N2(-5.525,-1.625) N3(-4.875,-1.625) N4(-4.225,-1.625) N5(-3.575,-1.625) N6(-2.925,-1.625) N7(-2.275,-1.625) N8(-1.625,-1.625) N9(-0.975,-1.625) N10(-0.325,-1.625) N11(0.325,-1.625) N12(0.975,-1.625) N13(1.625,-1.625) N14(2.275,-1.625) N15(2.925,-1.625) N16(3.575,-1.625) N17(4.225,-1.625) N18(4.875,-1.625) N19(5.525,-1.625) N20(6.175,-1.625) P1(-6.175,-2.275) P2(-5.525,-2.275) P3(-4.875,-2.275) P4(-4.225,-2.275) P5(-3.575,-2.275) P6(-2.925,-2.275) P7(-2.275,-2.275) P8(-1.625,-2.275) P9(-0.975,-2.275) P10(-0.325,-2.275) P11(0.325,-2.275) P12(0.975,-2.275) P13(1.625,-2.275) P14(2.275,-2.275) P15(2.925,-2.275) P16(3.575,-2.275) P17(4.225,-2.275) P18(4.875,-2.275) P19(5.525,-2.275) P20(6.175,-2.275) R1(-6.175,-2.925) R2(-5.525,-2.925) R3(-4.875,-2.925) R6(-2.925,-2.925) R7(-2.275,-2.925) R8(-1.625,-2.925) R9(-0.975,-2.925) R10(-0.325,-2.925) R11(0.325,-2.925) R12(0.975,-2.925) R13(1.625,-2.925) R14(2.275,-2.925) R15(2.925,-2.925) R16(3.575,-2.925) R17(4.225,-2.925) R18(4.875,-2.925) R19(5.525,-2.925) R20(6.175,-2.925) T1(-6.175,-3.575) T2(-5.525,-3.575) T3(-4.875,-3.575) T7(-2.275,-3.575) T8(-1.625,-3.575) T9(-0.975,-3.575) T10(-0.325,-3.575) T11(0.325,-3.575) T12(0.975,-3.575) T13(1.625,-3.575) T14(2.275,-3.575) T15(2.925,-3.575) T16(3.575,-3.575) T17(4.225,-3.575) T18(4.875,-3.575) T19(5.525,-3.575) T20(6.175,-3.575) U1(-6.175,-4.225) U2(-5.525,-4.225) U3(-4.875,-4.225) U6(-2.925,-4.225) U7(-2.275,-4.225) U8(-1.625,-4.225) U9(-0.975,-4.225) U10(-0.325,-4.225) U11(0.325,-4.225) U12(0.975,-4.225) U13(1.625,-4.225) U14(2.275,-4.225) U15(2.925,-4.225) U16(3.575,-4.225) U17(4.225,-4.225) U18(4.875,-4.225) U19(5.525,-4.225) U20(6.175,-4.225) V1(-6.175,-4.875) V2(-5.525,-4.875) V3(-4.875,-4.875) V4(-4.225,-4.875) V5(-3.575,-4.875) V6(-2.925,-4.875) V7(-2.275,-4.875) V8(-1.625,-4.875) V9(-0.975,-4.875) V10(-0.325,-4.875) V11(0.325,-4.875) V12(0.975,-4.875) V13(1.625,-4.875) V14(2.275,-4.875) V15(2.925,-4.875) V16(3.575,-4.875) V17(4.225,-4.875) V18(4.875,-4.875) V19(5.525,-4.875) V20(6.175,-4.875) W1(-6.175,-5.525) W2(-5.525,-5.525) W3(-4.875,-5.525) W4(-4.225,-5.525) W5(-3.575,-5.525) W6(-2.925,-5.525) W7(-2.275,-5.525) W8(-1.625,-5.525) W9(-0.975,-5.525) W10(-0.325,-5.525) W11(0.325,-5.525) W12(0.975,-5.525) W13(1.625,-5.525) W14(2.275,-5.525) W15(2.925,-5.525) W16(3.575,-5.525) W17(4.225,-5.525) W18(4.875,-5.525) W19(5.525,-5.525) W20(6.175,-5.525) Y1(-6.175,-6.175) Y2(-5.525,-6.175) Y3(-4.875,-6.175) Y4(-4.225,-6.175) Y5(-3.575,-6.175) Y6(-2.925,-6.175) Y7(-2.275,-6.175) Y8(-1.625,-6.175) Y9(-0.975,-6.175) Y10(-0.325,-6.175) Y11(0.325,-6.175) Y12(0.975,-6.175) Y13(1.625,-6.175) Y14(2.275,-6.175) Y15(2.925,-6.175) Y16(3.575,-6.175) Y17(4.225,-6.175) Y18(4.875,-6.175) Y19(5.525,-6.175) Y20(6.175,-6.175)
LED-SMD_4P-L3.5-W3.5-TL_WS2812B
  rect 1.545x0.997 hole 0.001: 1(1.637,-0.89) 2(1.637,0.89) 3(-1.637,0.89) 4(-1.637,-0.89)
MAGNETICS_10/100_BASET
  rect 2x0.75 hole 0.001: 1(-4,4.445) 2(-4,3.175) 3(-4,1.905) 4(-4,0.635) 5(-4,-0.635) 6(-4,-1.905) 7(-4,-3.175) 8(-4,-4.445) 9(4,-4.445) 10(4,-3.175) 11(4,-1.905) 12(4,-0.635) 13(4,0.635) 14(4,1.905) 15(4,3.175) 16(4,4.445)
MIC-TH_BD4.0-P1.40-D0.3-L
  rect 1x1 hole 0.5: 1(0.7,0)
  round 1 hole 0.5: 2(-0.7,0)
Pad_e1006
  round 6 hole 3.1: (0,0)
Pad_e1007
  round 6 hole 3.1: (0,0)
Pad_e1008
  round 6 hole 3.1: (0,0)
Pad_e1009
  round 6 hole 3.1: (0,0)
Pad_e1010
  round 5 hole 2.6: 1(0,0)
Pad_e1011
  round 5 hole 2.6: 1(0,0)
Pad_e1012
  round 5 hole 2.6: 1(0,0)
Pad_e1013
  round 5 hole 2.6: 1(0,0)
qfn44-0.9mm-12x12mm
  rect 1.125x0.5 hole 0.001: 1(-5.8,4.5) 2(-5.8,3.6) 3(-5.8,2.7) 4(-5.8,1.8) 5(-5.8,0.9) 6(-5.8,0) 7(-5.8,-0.9) 8(-5.8,-1.8) 9(-5.8,-2.7) 10(-5.8,-3.6) 11(-5.8,-4.5) 23(5.8,-4.5) 24(5.8,-3.6) 25(5.8,-2.7) 26(5.8,-1.8) 27(5.8,-0.9) 28(5.8,0) 29(5.8,0.9) 30(5.8,1.8) 31(5.8,2.7) 32(5.8,3.6) 33(5.8,4.5)
  rect 0.5x1.125 hole 0.001: 12(-4.5,-5.8) 13(-3.6,-5.8) 14(-2.7,-5.8) 15(-1.8,-5.8) 16(-0.9,-5.8) 17(0,-5.8) 18(0.9,-5.8) 19(1.8,-5.8) 20(2.7,-5.8) 21(3.6,-5.8) 22(4.5,-5.8) 34(4.5,5.8) 35(3.6,5.8) 36(2.7,5.8) 37(1.8,5.8) 38(0.9,5.8) 39(0,5.8) 40(-0.9,5.8) 41(-1.8,5.8) 42(-2.7,5.8) 43(-3.6,5.8) 44(-4.5,5.8)
QFN_24
  oval 0.7x0.28 hole 0.001: 1(-2,1.25) 2(-2,0.75) 3(-2,0.25) 4(-2,-0.25) 5(-2,-0.75) 6(-2,-1.25) 13(2,-1.25) 14(2,-0.75) 15(2,-0.25) 16(2,0.25) 17(2,0.75) 18(2,1.25)
  oval 0.28x0.7 hole 0.001: 7(-1.25,-2) 8(-0.75,-2) 9(-0.25,-2) 10(0.25,-2) 11(0.75,-2) 12(1.25,-2) 19(1.25,2) 20(0.75,2) 21(0.25,2) 22(-0.25,2) 23(-0.75,2) 24(-1.25,2)
  rect 2.68x2.68 hole 0.001: 25(0,0)
QFN_64_7P5X7P5_0P4
  rect 0.762x0.241 hole 0.001: 1(-3.8,3) 2(-3.8,2.6) 3(-3.8,2.2) 4(-3.8,1.8) 5(-3.8,1.4) 6(-3.8,1) 7(-3.8,0.6) 8(-3.8,0.2) 9(-3.8,-0.2) 10(-3.8,-0.6) 11(-3.8,-1) 12(-3.8,-1.4) 13(-3.8,-1.8) 14(-3.8,-2.2) 15(-3.8,-2.6) 16(-3.8,-3) 33(3.8,-3) 34(3.8,-2.6) 35(3.8,-2.2) 36(3.8,-1.8) 37(3.8,-1.4) 38(3.8,-1) 39(3.8,-0.6) 40(3.8,-0.2) 41(3.8,0.2) 42(3.8,0.6) 43(3.8,1) 44(3.8,1.4) 45(3.8,1.8) 46(3.8,2.2) 47(3.8,2.6) 48(3.8,3)
  rect 0.241x0.762 hole 0.001: 17(-3,-3.8) 18(-2.6,-3.8) 19(-2.2,-3.8) 20(-1.8,-3.8) 21(-1.4,-3.8) 22(-1,-3.8) 23(-0.6,-3.8) 24(-0.2,-3.8) 25(0.2,-3.8) 26(0.6,-3.8) 27(1,-3.8) 28(1.4,-3.8) 29(1.8,-3.8) 30(2.2,-3.8) 31(2.6,-3.8) 32(3,-3.8) 49(3,3.8) 50(2.6,3.8) 51(2.2,3.8) 52(1.8,3.8) 53(1.4,3.8) 54(1,3.8) 55(0.6,3.8) 56(0.2,3.8) 57(-0.2,3.8) 58(-0.6,3.8) 59(-1,3.8) 60(-1.4,3.8) 61(-1.8,3.8) 62(-2.2,3.8) 63(-2.6,3.8) 64(-3,3.8)
  rect 5x5 hole 0.001: 65(0,0)
R0201
  rect 0.305x0.305 hole 0.001: 1(0,0.305) 2(0,-0.305)
r0402
  rect 0.508x0.635 hole 0.001: 1(0,0.508) 2(0,-0.508)
R0603
  rect 0.762x0.889 hole 0.001: 1(0,0.762) 2(0,-0.762)
RJ45_RC01812
  rect 0.635x1.5 hole 0.001: 1(-3.57,-4.354) 2(-2.55,-4.354) 3(-1.53,-4.354) 4(-0.51,-4.354) 5(0.51,-4.354) 6(1.53,-4.354) 7(2.55,-4.354) 8(3.57,-4.354)
  rect 0.889x2.7 hole 0.001: 9(7.06,-3.112) 10(4.77,-3.112) 11(-4.77,-3.112) 12(-7.06,-3.112)
  oval 1.2x2.8 hole 0.7x2.2: 13(-8,4.1) 14(8,4.1)
SOD-523
  rect 0.6x0.7 hole 0.001: 1(-0.71,0) 2(0.71,0)
SOT23-3
  rect 0.95x1 hole 0.001: 1(-0.95,-1.125) 2(0.95,-1.125) 3(0,1.125)
SOT23-5
  rect 0.55x1.45 hole 0.001: 1(-0.95,-1.075) 2(0,-1.075) 3(0.95,-1.075) 4(0.95,1.075) 5(-0.95,1.075)
SOT143L
  rect 1x1 hole 0.001: 1(-1,0.75)
  rect 1x0.6 hole 0.001: 2(-1,-0.95) 3(1,-0.95) 4(1,0.95)
SOT-23-3_L2.9-W1.3-P1.90-LS2.4-BR
  rect 1.25x0.7 hole 0.001: 1(1,-0.95) 2(1,0.95) 3(-1,0)
SOT-23-3_L3.0-W1.7-P0.95-LS2.9-BR
  rect 1.038x0.532 hole 0.001: 1(1.101,-0.95) 2(1.101,0.95) 3(-1.101,0)
SOT-23-5_L3.0-W1.7-P0.95-LS2.8-BR
  rect 1.1x0.6 hole 0.001: 1(1.3,-0.95) 2(1.3,0) 3(1.3,0.95) 4(-1.3,0.95) 5(-1.3,-0.95)
SW-SMD_L4.0-W3.0-LS5.0
  rect 1.35x2 hole 0.001: 1(-2.2,0) 2(2.2,0)
SW-SMD_SHOU_TS36CA-0.6
  rect 1.2x1.2 hole 0.001: 1(2.1,0.938) 2(-2.15,0.912)
  custom 1.51x1.5 hole 0.001: 3(-3.45,-0.938)
  custom 1.5x1.51 hole 0.001: 4(3.45,-0.907)
TestPoint_D30
  round 0.762 hole 0.001: TP(0,0)
TF2
  rect 1.6x0.6 hole 0.001: 1(5.05,-2.25) 2(5.05,-1.15) 3(5.05,-0.05) 4(5.05,1.05) 5(5.05,2.15) 6(5.05,3.25) 7(5.05,4.35) 8(5.05,5.45) 9(5.05,6.55)
  rect 1.4x1.2 hole 0.001: 10(4.55,7.75)
  rect 2.2x1.2 hole 0.001: 11(-5.05,7.75) 12(-5.05,-7.75)
  rect 1.4x1.6 hole 0.001: 13(4.55,-6.85)
  round 1 hole 1: 14(-5.451,4.95) 15(-5.451,-3.05)
USB_TYPE_C
  rect 0.305x1.448 hole 0.001: A1(-3.375,3.139) A4(-2.6,3.139) A5(-1.25,3.139) A6(-0.25,3.139) A7(0.25,3.139) A8(1.25,3.139) A9(2.6,3.139) A12(3.375,3.139) B1(3.075,3.139) B4(2.3,3.139) B5(1.75,3.139) B6(0.75,3.139) B7(-0.75,3.139) B8(-1.75,3.139) B9(-2.3,3.139) B12(-3.075,3.139)
  oval 1x2.1 hole 0.6x1.7: P1(-4.32,2.295) P2(4.32,2.295)
  oval 1.27x1.778 hole 0.6x1.2: P3(-4.32,-1.885) P4(4.32,-1.885)
XTAL_3225
  rect 1.2x1 hole 0.001: 1(1.2,0.9) 2(-1.2,0.9) 3(-1.2,-0.9) 4(1.2,-0.9)

## Nets
As in the schematic, except:
